# Altium project RADAR_D79_24V_R9.PrjPcb (part 2 of 2)

## Sheet 23_Radar_bypass.SchDoc
size 289 x 400 mm
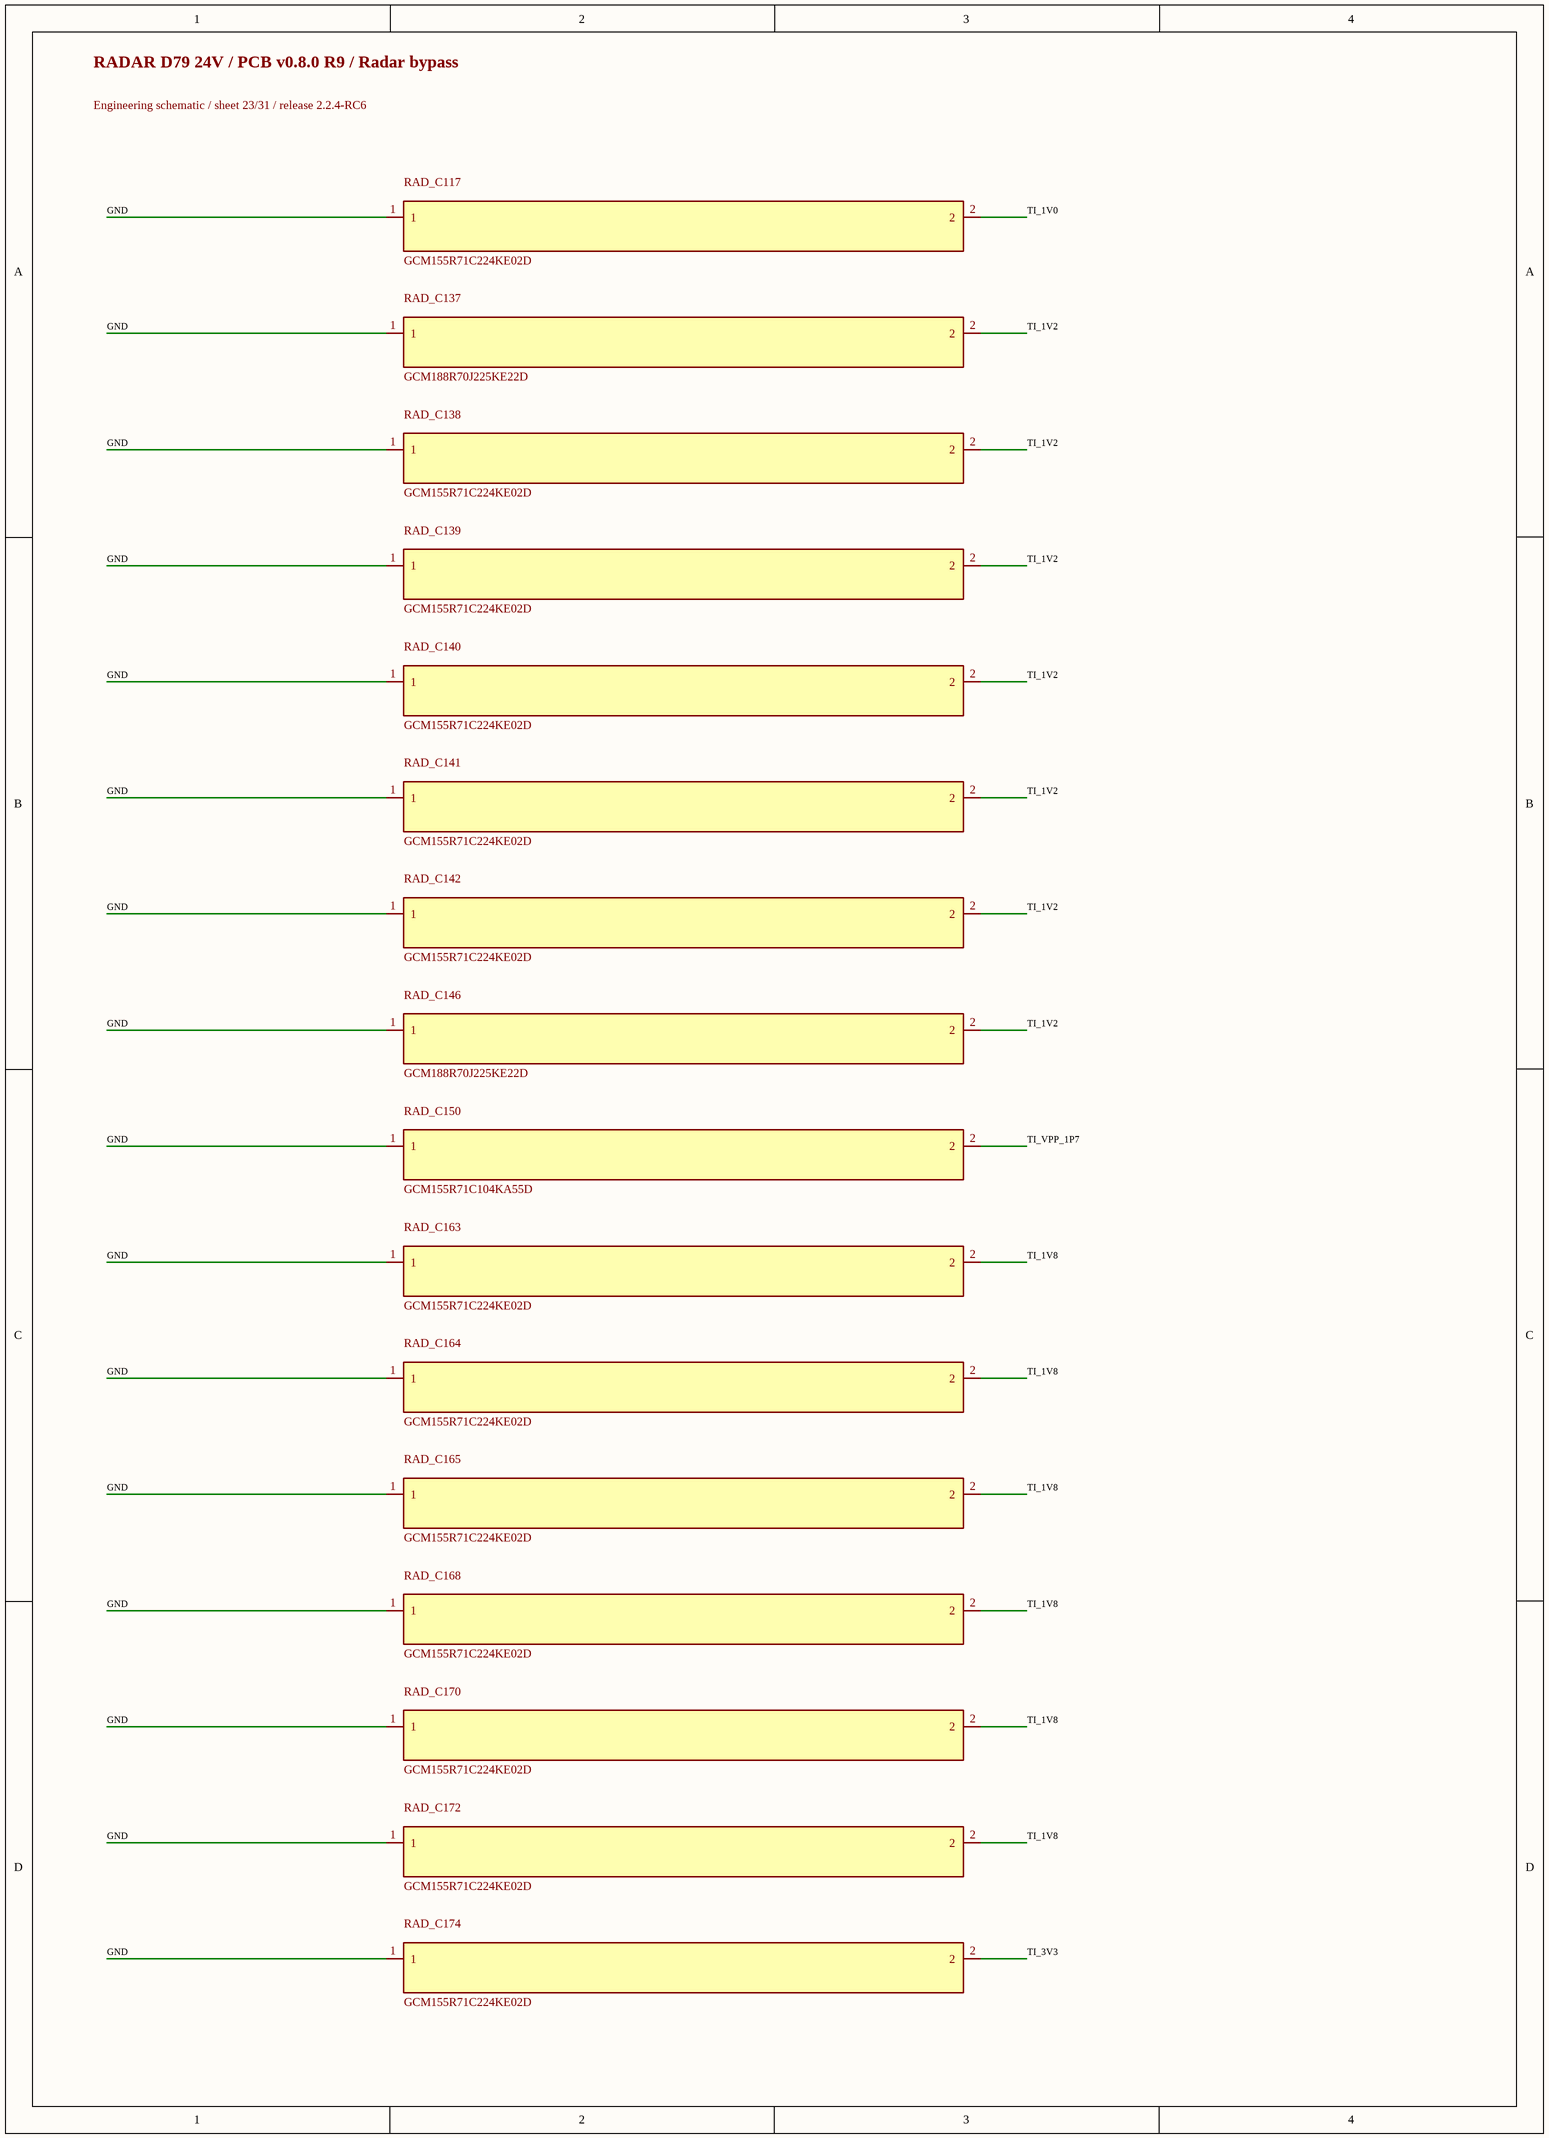
[diagram p23: 23_Radar_bypass.SchDoc]

### Parts
RAD_C117  GCM155R71C224KE02D  [0402L]
RAD_C137  GCM188R70J225KE22D  [0603L]
RAD_C138  GCM155R71C224KE02D  [0402L]
RAD_C139  GCM155R71C224KE02D  [0402L]
RAD_C140  GCM155R71C224KE02D  [0402L]
RAD_C141  GCM155R71C224KE02D  [0402L]
RAD_C142  GCM155R71C224KE02D  [0402L]
RAD_C146  GCM188R70J225KE22D  [0603L]
RAD_C150  GCM155R71C104KA55D  [0402L]
RAD_C163  GCM155R71C224KE02D  [0402L]
RAD_C164  GCM155R71C224KE02D  [0402L]
RAD_C165  GCM155R71C224KE02D  [0402L]
RAD_C168  GCM155R71C224KE02D  [0402L]
RAD_C170  GCM155R71C224KE02D  [0402L]
RAD_C172  GCM155R71C224KE02D  [0402L]
RAD_C174  GCM155R71C224KE02D  [0402L]

### Nets
GND: RAD_C117.1 RAD_C137.1 RAD_C138.1 RAD_C139.1 RAD_C140.1 RAD_C141.1 RAD_C142.1 RAD_C146.1 RAD_C150.1 RAD_C163.1 RAD_C164.1 RAD_C165.1 RAD_C168.1 RAD_C170.1 RAD_C172.1 RAD_C174.1
TI_1V0: RAD_C117.2
TI_1V2: RAD_C137.2 RAD_C138.2 RAD_C139.2 RAD_C140.2 RAD_C141.2 RAD_C142.2 RAD_C146.2
TI_1V8: RAD_C163.2 RAD_C164.2 RAD_C165.2 RAD_C168.2 RAD_C170.2 RAD_C172.2
TI_3V3: RAD_C174.2
TI_VPP_1P7: RAD_C150.2

### Notes on the sheet
- RADAR D79 24V / PCB v0.8.0 R9 / Radar bypass
- Engineering schematic / sheet 23/31 / release 2.2.4-RC6

## Sheet 24_Radar_bypass.SchDoc
size 289 x 396 mm
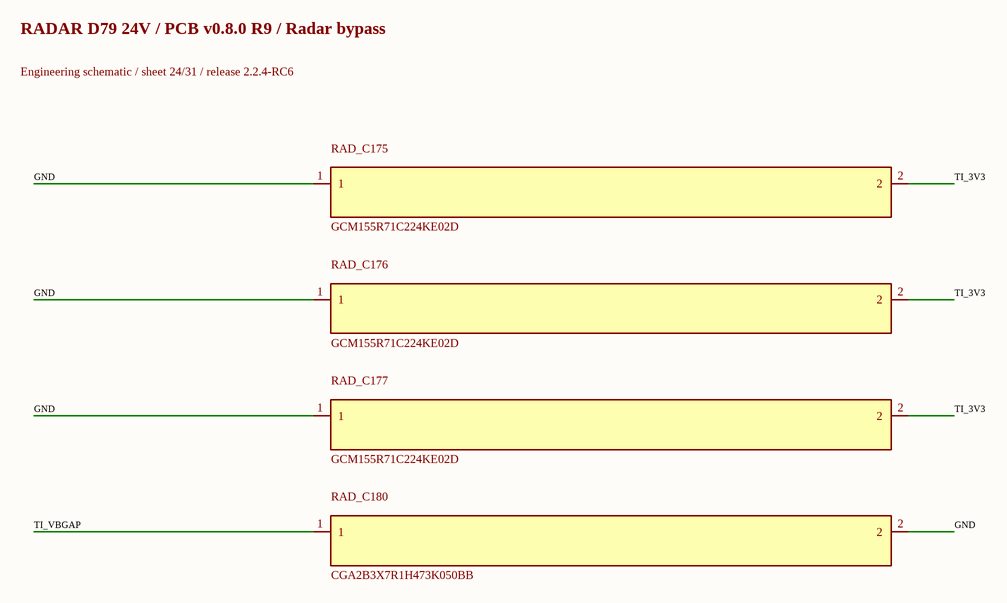
[diagram p24: 24_Radar_bypass.SchDoc]

### Parts
RAD_C175  GCM155R71C224KE02D  [0402L]
RAD_C176  GCM155R71C224KE02D  [0402L]
RAD_C177  GCM155R71C224KE02D  [0402L]
RAD_C180  CGA2B3X7R1H473K050BB  [0402L]

### Nets
GND: RAD_C175.1 RAD_C176.1 RAD_C177.1 RAD_C180.2
TI_3V3: RAD_C175.2 RAD_C176.2 RAD_C177.2
TI_VBGAP: RAD_C180.1

### Notes on the sheet
- RADAR D79 24V / PCB v0.8.0 R9 / Radar bypass
- Engineering schematic / sheet 24/31 / release 2.2.4-RC6

## Sheet 25_Radar_PMIC_and_rail_filters.SchDoc
size 289 x 396 mm
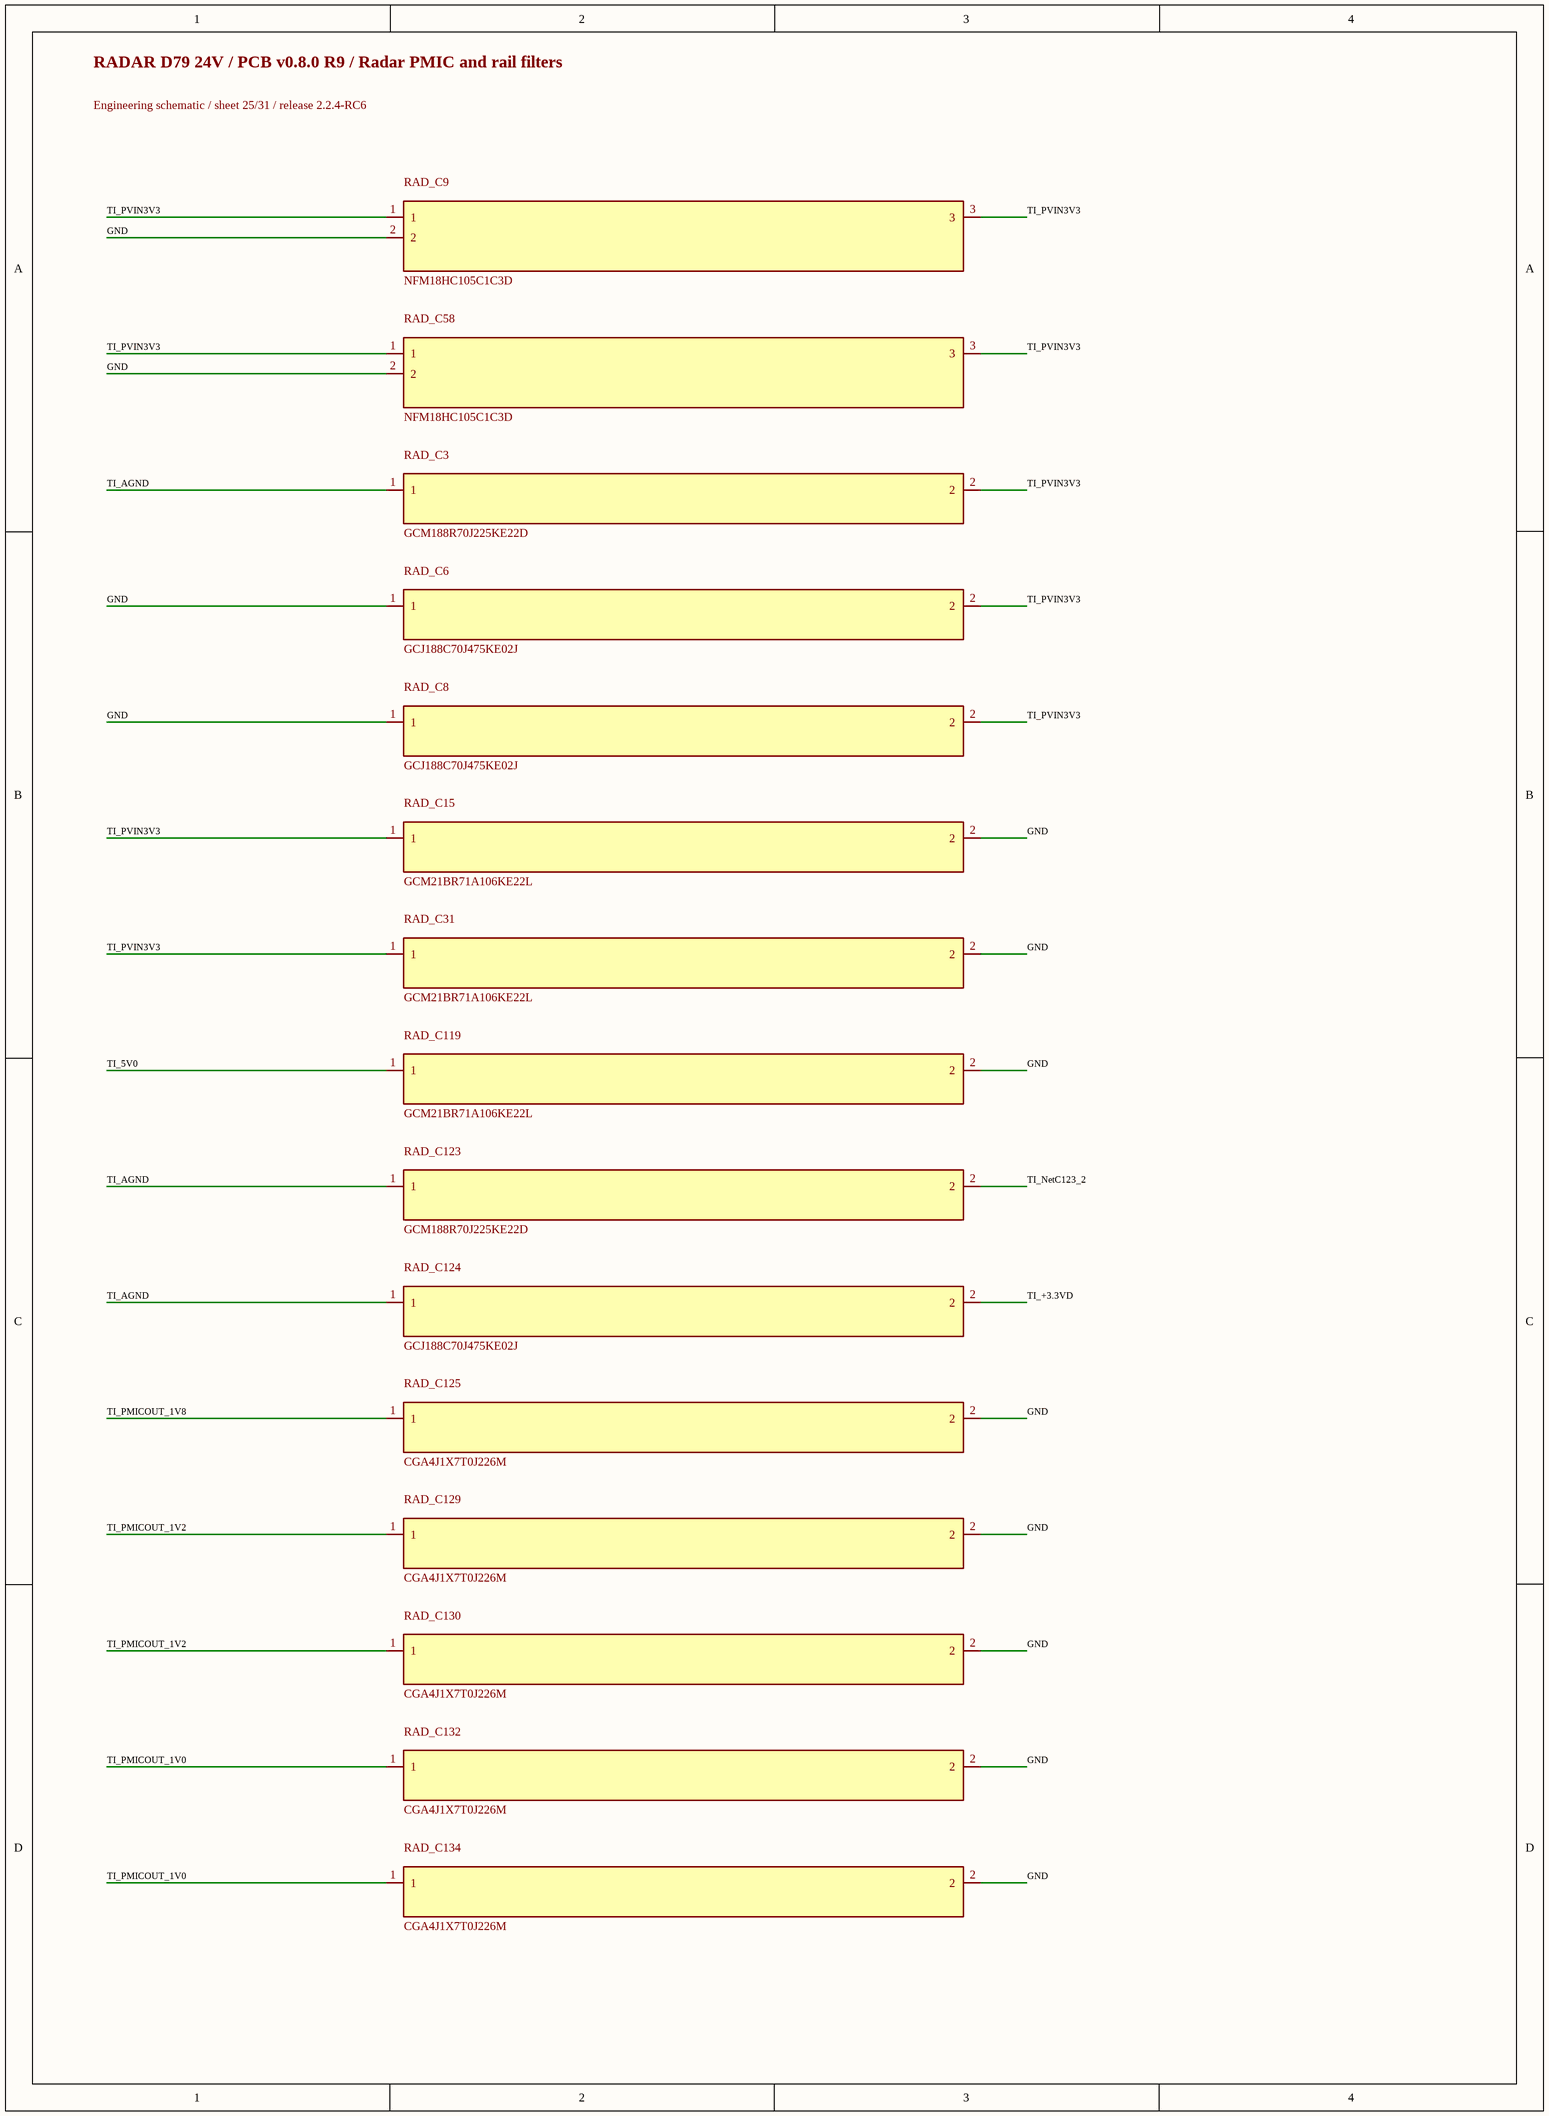
[diagram p25: 25_Radar_PMIC_and_rail_filters.SchDoc]

### Parts
RAD_C3  GCM188R70J225KE22D  [0603L]
RAD_C6  GCJ188C70J475KE02J  [FP-GCJ188C70J475KE02J_0603-MFG]
RAD_C8  GCJ188C70J475KE02J  [FP-GCJ188C70J475KE02J_0603-MFG]
RAD_C9  NFM18HC105C1C3D  [FP-NFM18HC105C1C3D_0603-MFG]
RAD_C15  GCM21BR71A106KE22L  [0805L]
RAD_C31  GCM21BR71A106KE22L  [0805L]
RAD_C58  NFM18HC105C1C3D  [FP-NFM18HC105C1C3D_0603-MFG]
RAD_C119  GCM21BR71A106KE22L  [0805L]
RAD_C123  GCM188R70J225KE22D  [0603L]
RAD_C124  GCJ188C70J475KE02J  [FP-GCJ188C70J475KE02J_0603-MFG]
RAD_C125  CGA4J1X7T0J226M  [0805_155]
RAD_C129  CGA4J1X7T0J226M  [0805_155]
RAD_C130  CGA4J1X7T0J226M  [0805_155]
RAD_C132  CGA4J1X7T0J226M  [0805_155]
RAD_C134  CGA4J1X7T0J226M  [0805_155]

### Nets
GND: RAD_C6.1 RAD_C8.1 RAD_C9.2 RAD_C15.2 RAD_C31.2 RAD_C58.2 RAD_C119.2 RAD_C125.2 RAD_C129.2 RAD_C130.2 RAD_C132.2 RAD_C134.2
TI_5V0: RAD_C119.1
TI_+3.3VD: RAD_C124.2
TI_AGND: RAD_C3.1 RAD_C123.1 RAD_C124.1
TI_NetC123_2: RAD_C123.2
TI_PMICOUT_1V0: RAD_C132.1 RAD_C134.1
TI_PMICOUT_1V2: RAD_C129.1 RAD_C130.1
TI_PMICOUT_1V8: RAD_C125.1
TI_PVIN3V3: RAD_C3.2 RAD_C6.2 RAD_C8.2 RAD_C9.1 RAD_C9.3 RAD_C15.1 RAD_C31.1 RAD_C58.1 RAD_C58.3

### Notes on the sheet
- RADAR D79 24V / PCB v0.8.0 R9 / Radar PMIC and rail filters
- Engineering schematic / sheet 25/31 / release 2.2.4-RC6

## Sheet 26_Radar_PMIC_and_rail_filters.SchDoc
size 289 x 400 mm
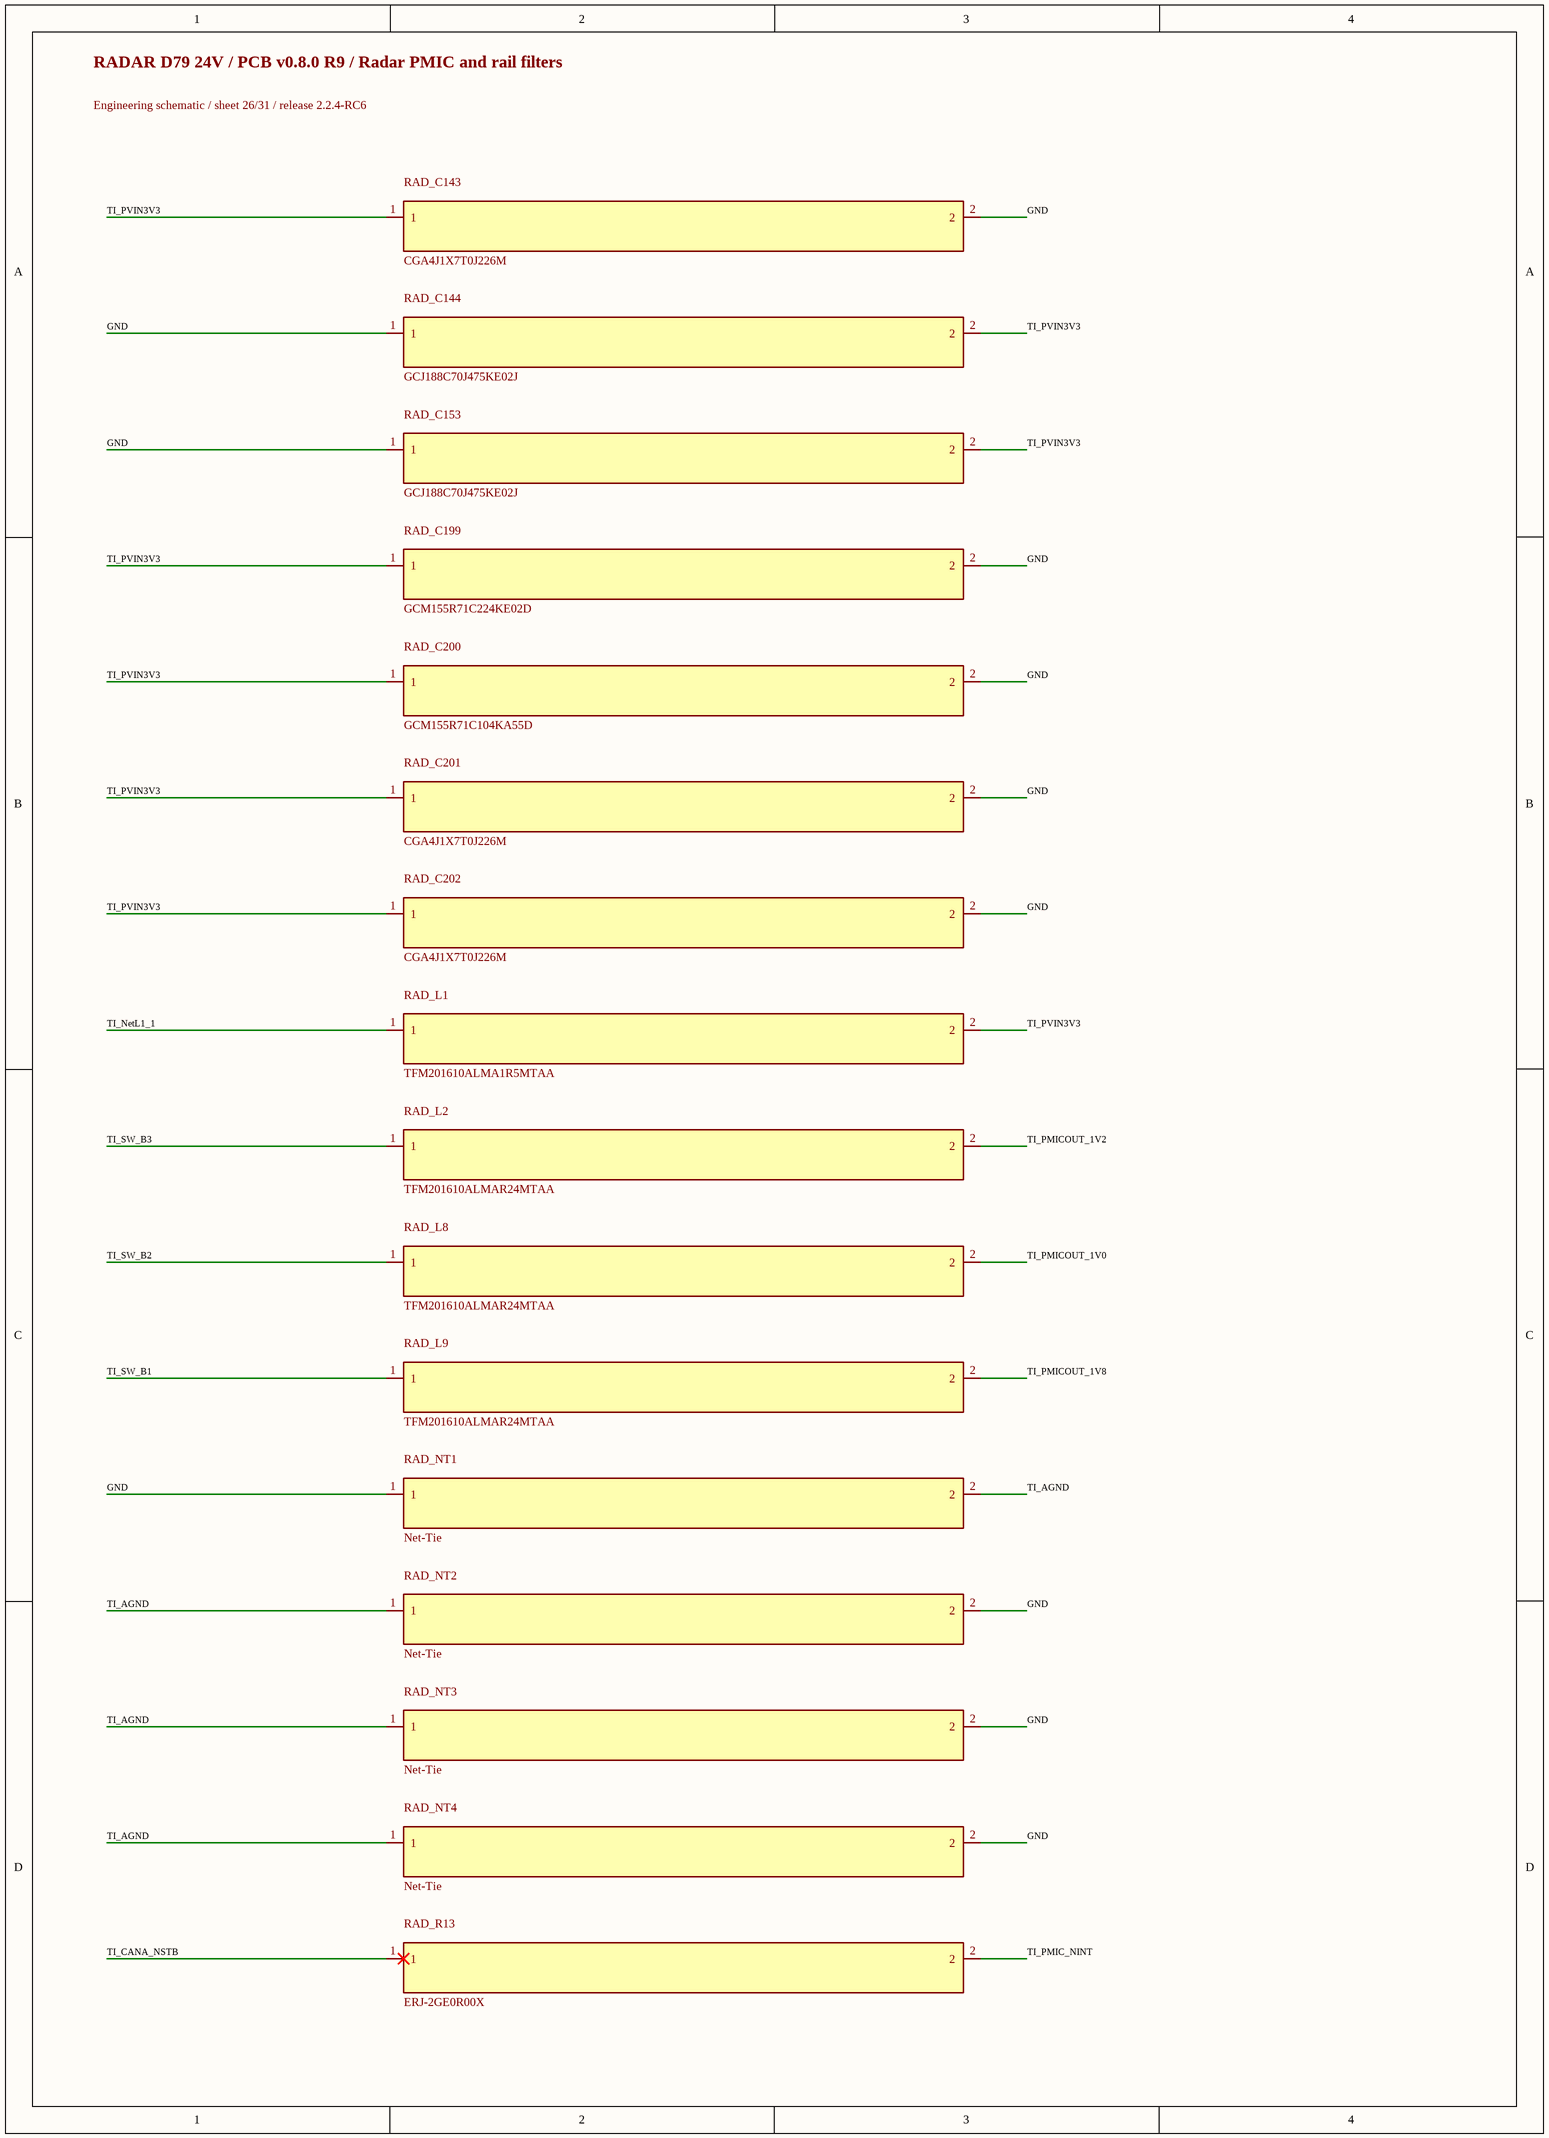
[diagram p26: 26_Radar_PMIC_and_rail_filters.SchDoc]

### Parts
RAD_C143  CGA4J1X7T0J226M  [0805_155]
RAD_C144  GCJ188C70J475KE02J  [FP-GCJ188C70J475KE02J_0603-MFG]
RAD_C153  GCJ188C70J475KE02J  [FP-GCJ188C70J475KE02J_0603-MFG]
RAD_C199  GCM155R71C224KE02D  [0402L]
RAD_C200  GCM155R71C104KA55D  [0402L]
RAD_C201  CGA4J1X7T0J226M  [0805_155]
RAD_C202  CGA4J1X7T0J226M  [0805_155]
RAD_L1  TFM201610ALMA1R5MTAA  [TFM201610ALMA]
RAD_L2  TFM201610ALMAR24MTAA  [FP-TFM201610ALMAR24MTAA_0806 (2016 Metric)-MFG]
RAD_L8  TFM201610ALMAR24MTAA  [FP-TFM201610ALMAR24MTAA_0806 (2016 Metric)-MFG]
RAD_L9  TFM201610ALMAR24MTAA  [FP-TFM201610ALMAR24MTAA_0806 (2016 Metric)-MFG]
RAD_NT1  Net-Tie  [Net-Tie_50milWide_30milLong]  (net tie, no BOM)
RAD_NT2  Net-Tie  [Net-Tie_50milWide_30milLong]  (net tie, no BOM)
RAD_NT3  Net-Tie  [Net-Tie_50milWide_30milLong]  (net tie, no BOM)
RAD_NT4  Net-Tie  [Net-Tie_50milWide_30milLong]  (net tie, no BOM)
RAD_R13  ERJ-2GE0R00X  [0402L]

### Nets
GND: RAD_C143.2 RAD_C144.1 RAD_C153.1 RAD_C199.2 RAD_C200.2 RAD_C201.2 RAD_C202.2 RAD_NT1.1 RAD_NT2.2 RAD_NT3.2 RAD_NT4.2
TI_AGND: RAD_NT1.2 RAD_NT2.1 RAD_NT3.1 RAD_NT4.1
TI_CANA_NSTB: RAD_R13.1
TI_NetL1_1: RAD_L1.1
TI_PMIC_NINT: RAD_R13.2
TI_PMICOUT_1V0: RAD_L8.2
TI_PMICOUT_1V2: RAD_L2.2
TI_PMICOUT_1V8: RAD_L9.2
TI_PVIN3V3: RAD_C143.1 RAD_C144.2 RAD_C153.2 RAD_C199.1 RAD_C200.1 RAD_C201.1 RAD_C202.1 RAD_L1.2
TI_SW_B1: RAD_L9.1
TI_SW_B2: RAD_L8.1
TI_SW_B3: RAD_L2.1

### Notes on the sheet
- RADAR D79 24V / PCB v0.8.0 R9 / Radar PMIC and rail filters
- Engineering schematic / sheet 26/31 / release 2.2.4-RC6

## Sheet 27_Radar_PMIC_and_rail_filters.SchDoc
size 289 x 400 mm
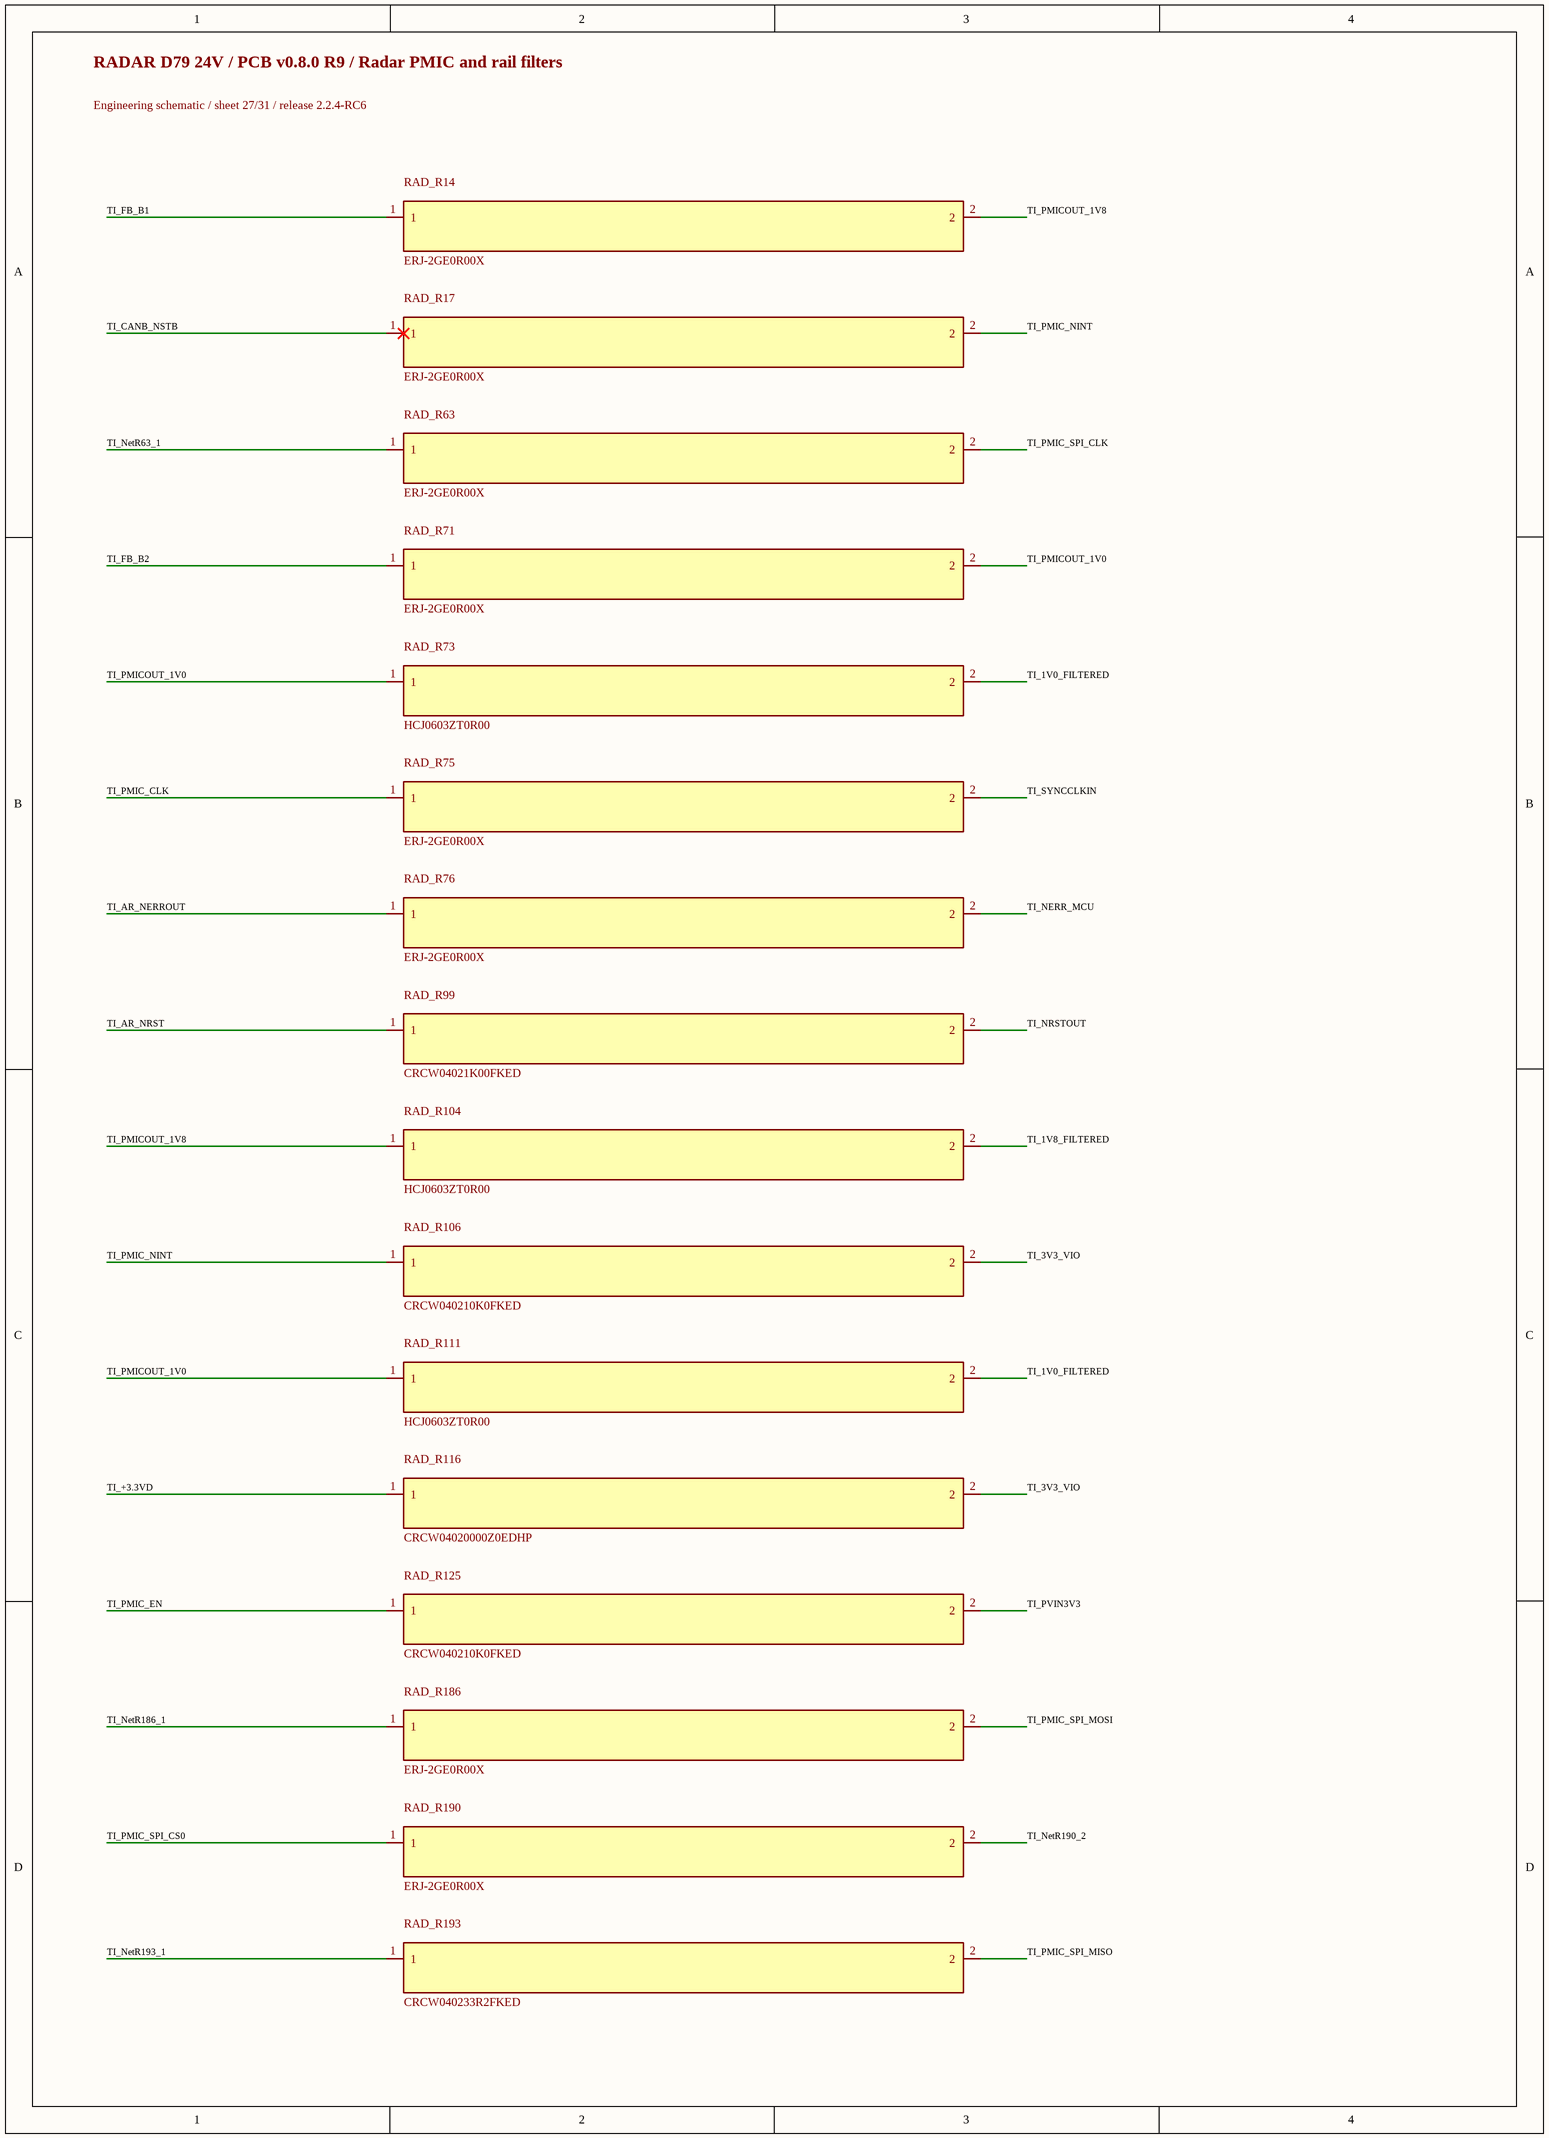
[diagram p27: 27_Radar_PMIC_and_rail_filters.SchDoc]

### Parts
RAD_R14  ERJ-2GE0R00X  [0402L]
RAD_R17  ERJ-2GE0R00X  [0402L]
RAD_R63  ERJ-2GE0R00X  [0402L]
RAD_R71  ERJ-2GE0R00X  [0402L]
RAD_R73  HCJ0603ZT0R00  [FP-HCJ0603ZT0R00_0603-MFG]
RAD_R75  ERJ-2GE0R00X  [0402L]
RAD_R76  ERJ-2GE0R00X  [0402L]
RAD_R99  CRCW04021K00FKED  [0402L]
RAD_R104  HCJ0603ZT0R00  [FP-HCJ0603ZT0R00_0603-MFG]
RAD_R106  CRCW040210K0FKED  [0402L]
RAD_R111  HCJ0603ZT0R00  [FP-HCJ0603ZT0R00_0603-MFG]
RAD_R116  CRCW04020000Z0EDHP  [0402L]
RAD_R125  CRCW040210K0FKED  [0402L]
RAD_R186  ERJ-2GE0R00X  [0402L]
RAD_R190  ERJ-2GE0R00X  [0402L]
RAD_R193  CRCW040233R2FKED  [0402L]

### Nets
TI_1V0_FILTERED: RAD_R73.2 RAD_R111.2
TI_1V8_FILTERED: RAD_R104.2
TI_3V3_VIO: RAD_R106.2 RAD_R116.2
TI_+3.3VD: RAD_R116.1
TI_AR_NERROUT: RAD_R76.1
TI_AR_NRST: RAD_R99.1
TI_CANB_NSTB: RAD_R17.1
TI_FB_B1: RAD_R14.1
TI_FB_B2: RAD_R71.1
TI_NERR_MCU: RAD_R76.2
TI_NetR63_1: RAD_R63.1
TI_NetR186_1: RAD_R186.1
TI_NetR190_2: RAD_R190.2
TI_NetR193_1: RAD_R193.1
TI_NRSTOUT: RAD_R99.2
TI_PMIC_CLK: RAD_R75.1
TI_PMIC_EN: RAD_R125.1
TI_PMIC_NINT: RAD_R17.2 RAD_R106.1
TI_PMIC_SPI_CLK: RAD_R63.2
TI_PMIC_SPI_CS0: RAD_R190.1
TI_PMIC_SPI_MISO: RAD_R193.2
TI_PMIC_SPI_MOSI: RAD_R186.2
TI_PMICOUT_1V0: RAD_R71.2 RAD_R73.1 RAD_R111.1
TI_PMICOUT_1V8: RAD_R14.2 RAD_R104.1
TI_PVIN3V3: RAD_R125.2
TI_SYNCCLKIN: RAD_R75.2

### Notes on the sheet
- RADAR D79 24V / PCB v0.8.0 R9 / Radar PMIC and rail filters
- Engineering schematic / sheet 27/31 / release 2.2.4-RC6

## Sheet 28_Radar_PMIC_and_rail_filters.SchDoc
size 289 x 396 mm
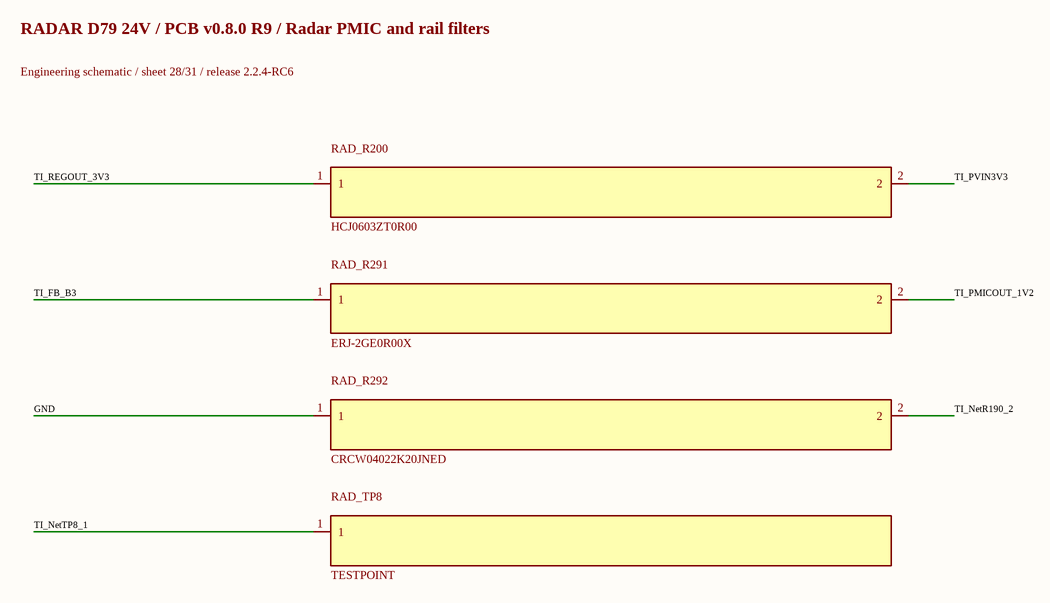
[diagram p28: 28_Radar_PMIC_and_rail_filters.SchDoc]

### Parts
RAD_R200  HCJ0603ZT0R00  [FP-HCJ0603ZT0R00_0603-MFG]
RAD_R291  ERJ-2GE0R00X  [0402L]
RAD_R292  CRCW04022K20JNED  [0402L]
RAD_TP8  TESTPOINT  [TP_25MIL-SMT]

### Nets
GND: RAD_R292.1
TI_FB_B3: RAD_R291.1
TI_NetR190_2: RAD_R292.2
TI_NetTP8_1: RAD_TP8.1
TI_PMICOUT_1V2: RAD_R291.2
TI_PVIN3V3: RAD_R200.2
TI_REGOUT_3V3: RAD_R200.1

### Notes on the sheet
- RADAR D79 24V / PCB v0.8.0 R9 / Radar PMIC and rail filters
- Engineering schematic / sheet 28/31 / release 2.2.4-RC6

## Sheet 29_Radar_rail_selection_and_sensing.SchDoc
size 289 x 396 mm
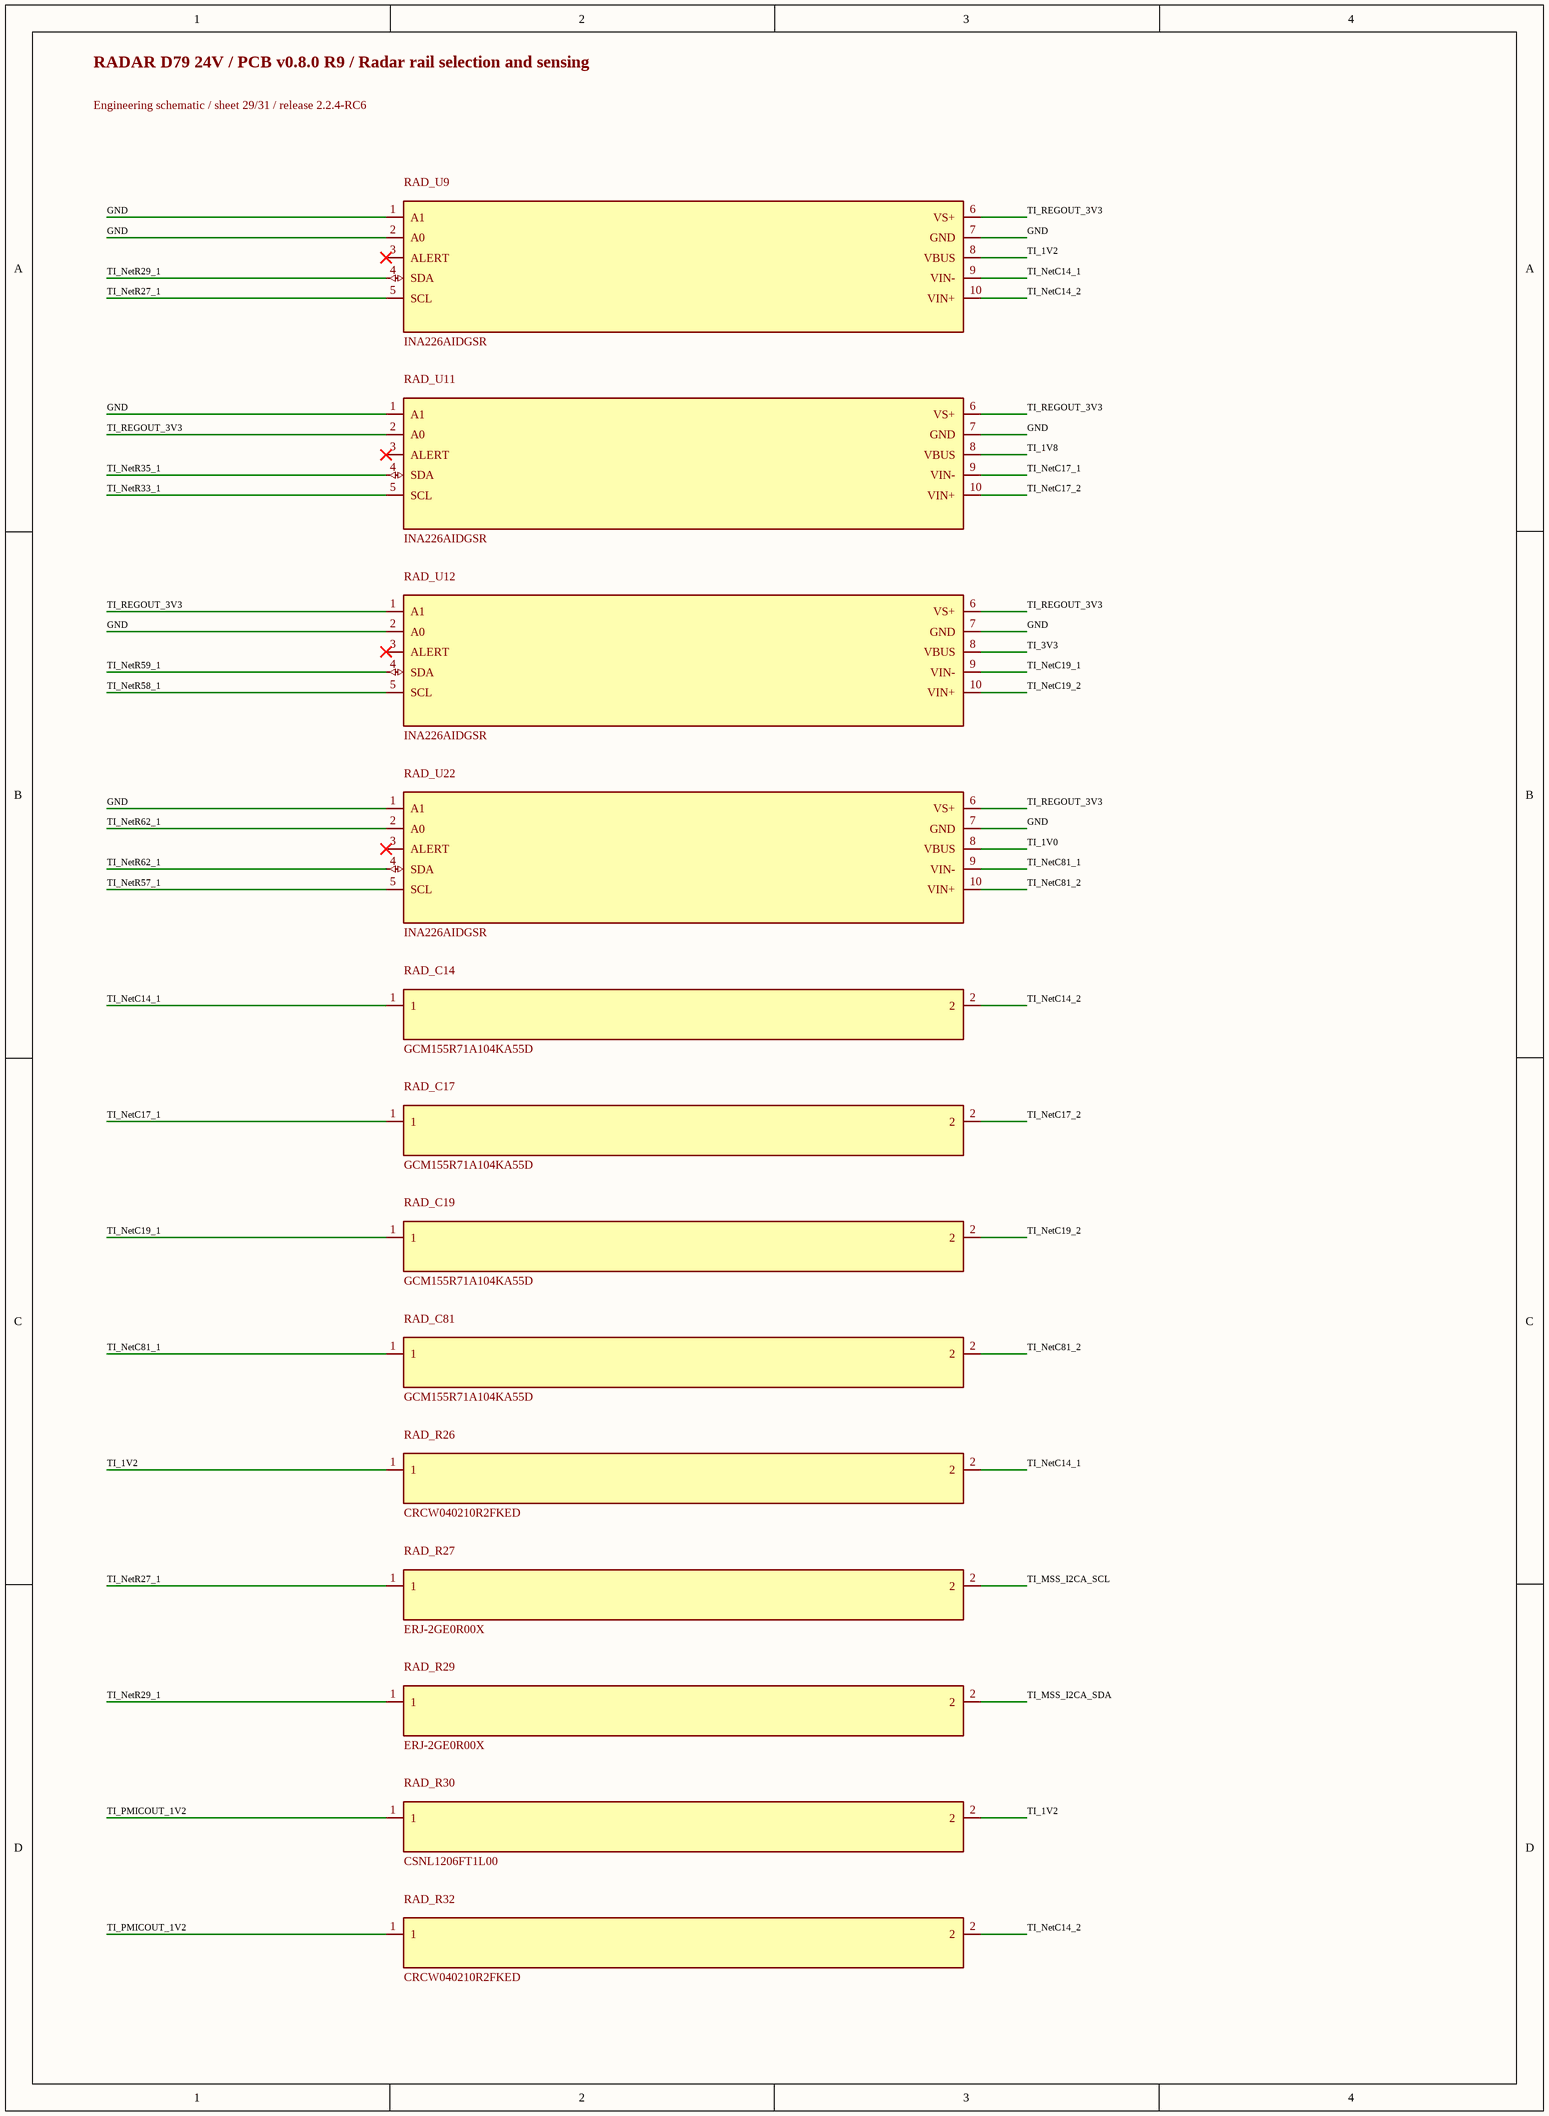
[diagram p29: 29_Radar_rail_selection_and_sensing.SchDoc]

### Parts
RAD_C14  GCM155R71A104KA55D  [0402L]
RAD_C17  GCM155R71A104KA55D  [0402L]
RAD_C19  GCM155R71A104KA55D  [0402L]
RAD_C81  GCM155R71A104KA55D  [0402L]
RAD_R26  CRCW040210R2FKED  [0402L]
RAD_R27  ERJ-2GE0R00X  [0402L]
RAD_R29  ERJ-2GE0R00X  [0402L]
RAD_R30  CSNL1206FT1L00  [1206L]
RAD_R32  CRCW040210R2FKED  [0402L]
RAD_U9  INA226AIDGSR  [DGS0010A_L]
RAD_U11  INA226AIDGSR  [DGS0010A_L]
RAD_U12  INA226AIDGSR  [DGS0010A_L]
RAD_U22  INA226AIDGSR  [DGS0010A_L]

### Nets
GND: RAD_U9.1(A1) RAD_U9.2(A0) RAD_U9.7(GND) RAD_U11.1(A1) RAD_U11.7(GND) RAD_U12.2(A0) RAD_U12.7(GND) RAD_U22.1(A1) RAD_U22.7(GND)
TI_1V0: RAD_U22.8(VBUS)
TI_1V2: RAD_R26.1 RAD_R30.2 RAD_U9.8(VBUS)
TI_1V8: RAD_U11.8(VBUS)
TI_3V3: RAD_U12.8(VBUS)
TI_MSS_I2CA_SCL: RAD_R27.2
TI_MSS_I2CA_SDA: RAD_R29.2
TI_NetC14_1: RAD_C14.1 RAD_R26.2 RAD_U9.9(VIN-)
TI_NetC14_2: RAD_C14.2 RAD_R32.2 RAD_U9.10(VIN+)
TI_NetC17_1: RAD_C17.1 RAD_U11.9(VIN-)
TI_NetC17_2: RAD_C17.2 RAD_U11.10(VIN+)
TI_NetC19_1: RAD_C19.1 RAD_U12.9(VIN-)
TI_NetC19_2: RAD_C19.2 RAD_U12.10(VIN+)
TI_NetC81_1: RAD_C81.1 RAD_U22.9(VIN-)
TI_NetC81_2: RAD_C81.2 RAD_U22.10(VIN+)
TI_NetR27_1: RAD_R27.1 RAD_U9.5(SCL)
TI_NetR29_1: RAD_R29.1 RAD_U9.4(SDA)
TI_NetR33_1: RAD_U11.5(SCL)
TI_NetR35_1: RAD_U11.4(SDA)
TI_NetR57_1: RAD_U22.5(SCL)
TI_NetR58_1: RAD_U12.5(SCL)
TI_NetR59_1: RAD_U12.4(SDA)
TI_NetR62_1: RAD_U22.2(A0) RAD_U22.4(SDA)
TI_PMICOUT_1V2: RAD_R30.1 RAD_R32.1
TI_REGOUT_3V3: RAD_U9.6(VS+) RAD_U11.2(A0) RAD_U11.6(VS+) RAD_U12.1(A1) RAD_U12.6(VS+) RAD_U22.6(VS+)

Not connected (* = marked no-connect by the designer): RAD_U9 3(ALERT)*; RAD_U11 3(ALERT)*; RAD_U12 3(ALERT)*; RAD_U22 3(ALERT)*

### Notes on the sheet
- RADAR D79 24V / PCB v0.8.0 R9 / Radar rail selection and sensing
- Engineering schematic / sheet 29/31 / release 2.2.4-RC6

## Sheet 30_Radar_rail_selection_and_sensing.SchDoc
size 289 x 396 mm
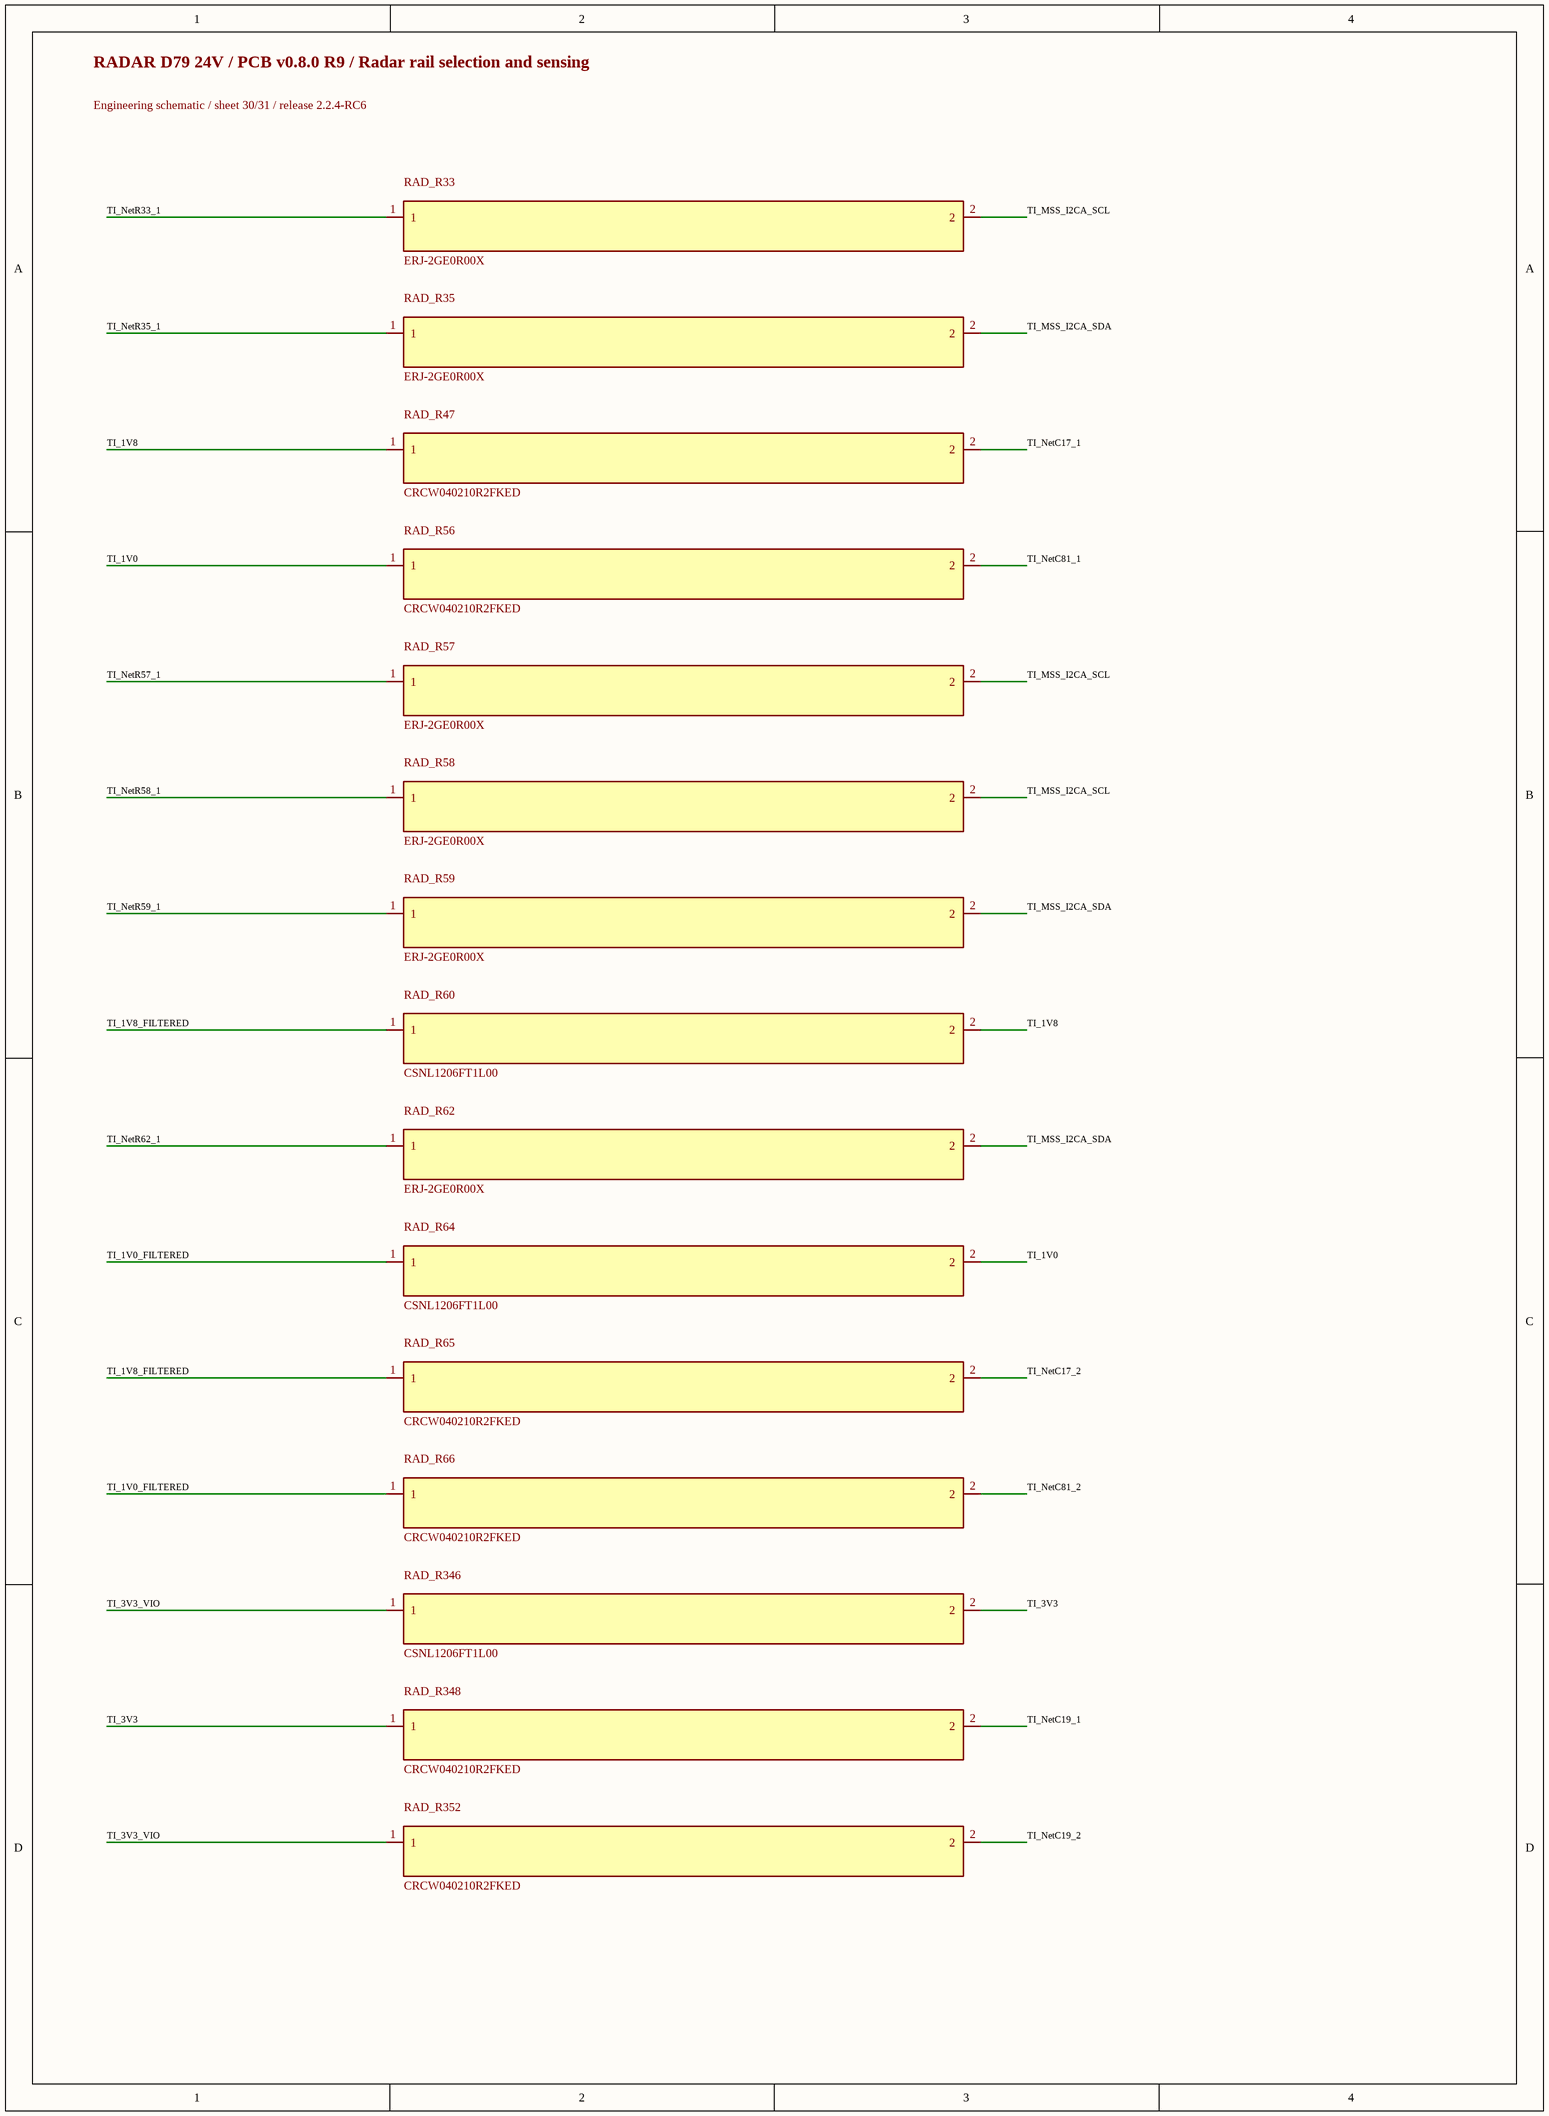
[diagram p30: 30_Radar_rail_selection_and_sensing.SchDoc]

### Parts
RAD_R33  ERJ-2GE0R00X  [0402L]
RAD_R35  ERJ-2GE0R00X  [0402L]
RAD_R47  CRCW040210R2FKED  [0402L]
RAD_R56  CRCW040210R2FKED  [0402L]
RAD_R57  ERJ-2GE0R00X  [0402L]
RAD_R58  ERJ-2GE0R00X  [0402L]
RAD_R59  ERJ-2GE0R00X  [0402L]
RAD_R60  CSNL1206FT1L00  [1206L]
RAD_R62  ERJ-2GE0R00X  [0402L]
RAD_R64  CSNL1206FT1L00  [1206L]
RAD_R65  CRCW040210R2FKED  [0402L]
RAD_R66  CRCW040210R2FKED  [0402L]
RAD_R346  CSNL1206FT1L00  [1206L]
RAD_R348  CRCW040210R2FKED  [0402L]
RAD_R352  CRCW040210R2FKED  [0402L]

### Nets
TI_1V0: RAD_R56.1 RAD_R64.2
TI_1V0_FILTERED: RAD_R64.1 RAD_R66.1
TI_1V8: RAD_R47.1 RAD_R60.2
TI_1V8_FILTERED: RAD_R60.1 RAD_R65.1
TI_3V3: RAD_R346.2 RAD_R348.1
TI_3V3_VIO: RAD_R346.1 RAD_R352.1
TI_MSS_I2CA_SCL: RAD_R33.2 RAD_R57.2 RAD_R58.2
TI_MSS_I2CA_SDA: RAD_R35.2 RAD_R59.2 RAD_R62.2
TI_NetC17_1: RAD_R47.2
TI_NetC17_2: RAD_R65.2
TI_NetC19_1: RAD_R348.2
TI_NetC19_2: RAD_R352.2
TI_NetC81_1: RAD_R56.2
TI_NetC81_2: RAD_R66.2
TI_NetR33_1: RAD_R33.1
TI_NetR35_1: RAD_R35.1
TI_NetR57_1: RAD_R57.1
TI_NetR58_1: RAD_R58.1
TI_NetR59_1: RAD_R59.1
TI_NetR62_1: RAD_R62.1

### Notes on the sheet
- RADAR D79 24V / PCB v0.8.0 R9 / Radar rail selection and sensing
- Engineering schematic / sheet 30/31 / release 2.2.4-RC6

## Sheet 31_Radar_VPP_service.SchDoc
size 289 x 396 mm
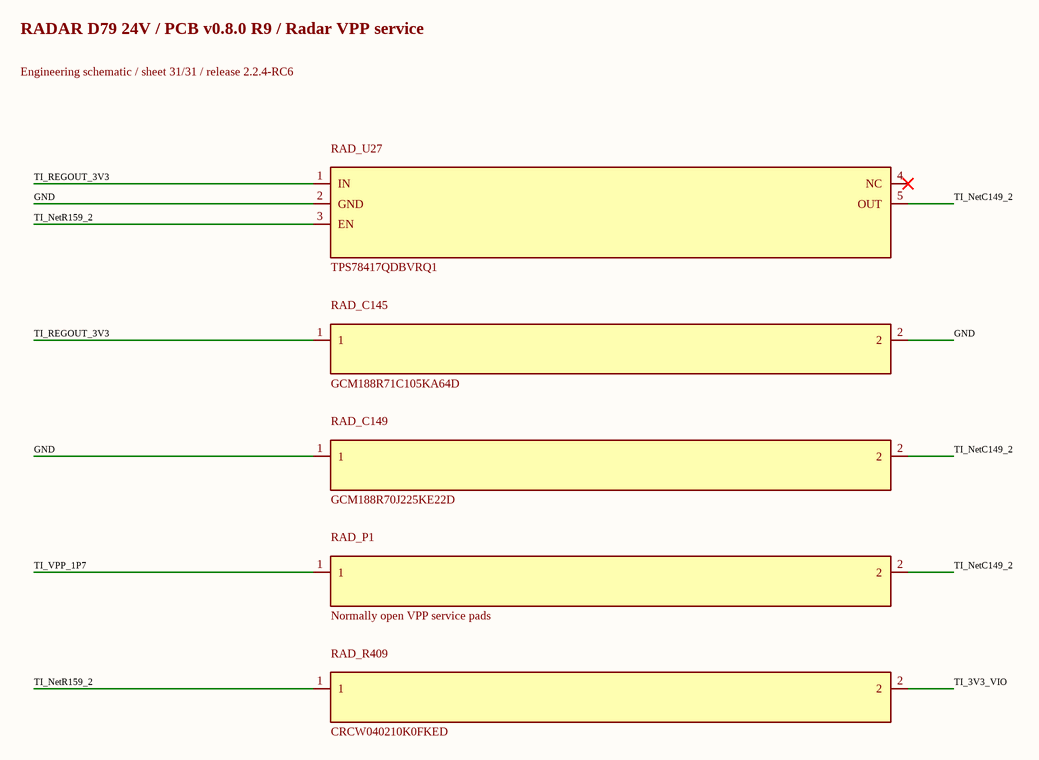
[diagram p31: 31_Radar_VPP_service.SchDoc]

### Parts
RAD_C145  GCM188R71C105KA64D  [0603L]
RAD_C149  GCM188R70J225KE22D  [0603L]
RAD_P1  Normally open VPP service pads  [VPP_SERVICE_SMT_D1p5_P2p5]
RAD_R409  CRCW040210K0FKED  [0402L]
RAD_U27  TPS78417QDBVRQ1  [DBV0005A-MFG]

### Nets
GND: RAD_C145.2 RAD_C149.1 RAD_U27.2(GND)
TI_3V3_VIO: RAD_R409.2
TI_NetC149_2: RAD_C149.2 RAD_P1.2 RAD_U27.5(OUT)
TI_NetR159_2: RAD_R409.1 RAD_U27.3(EN)
TI_REGOUT_3V3: RAD_C145.1 RAD_U27.1(IN)
TI_VPP_1P7: RAD_P1.1

Not connected (* = marked no-connect by the designer): RAD_U27 4(NC)*

### Notes on the sheet
- RADAR D79 24V / PCB v0.8.0 R9 / Radar VPP service
- Engineering schematic / sheet 31/31 / release 2.2.4-RC6

## Sheet 00_SYSTEM_OVERVIEW.SchDoc
size 840 x 594 mm
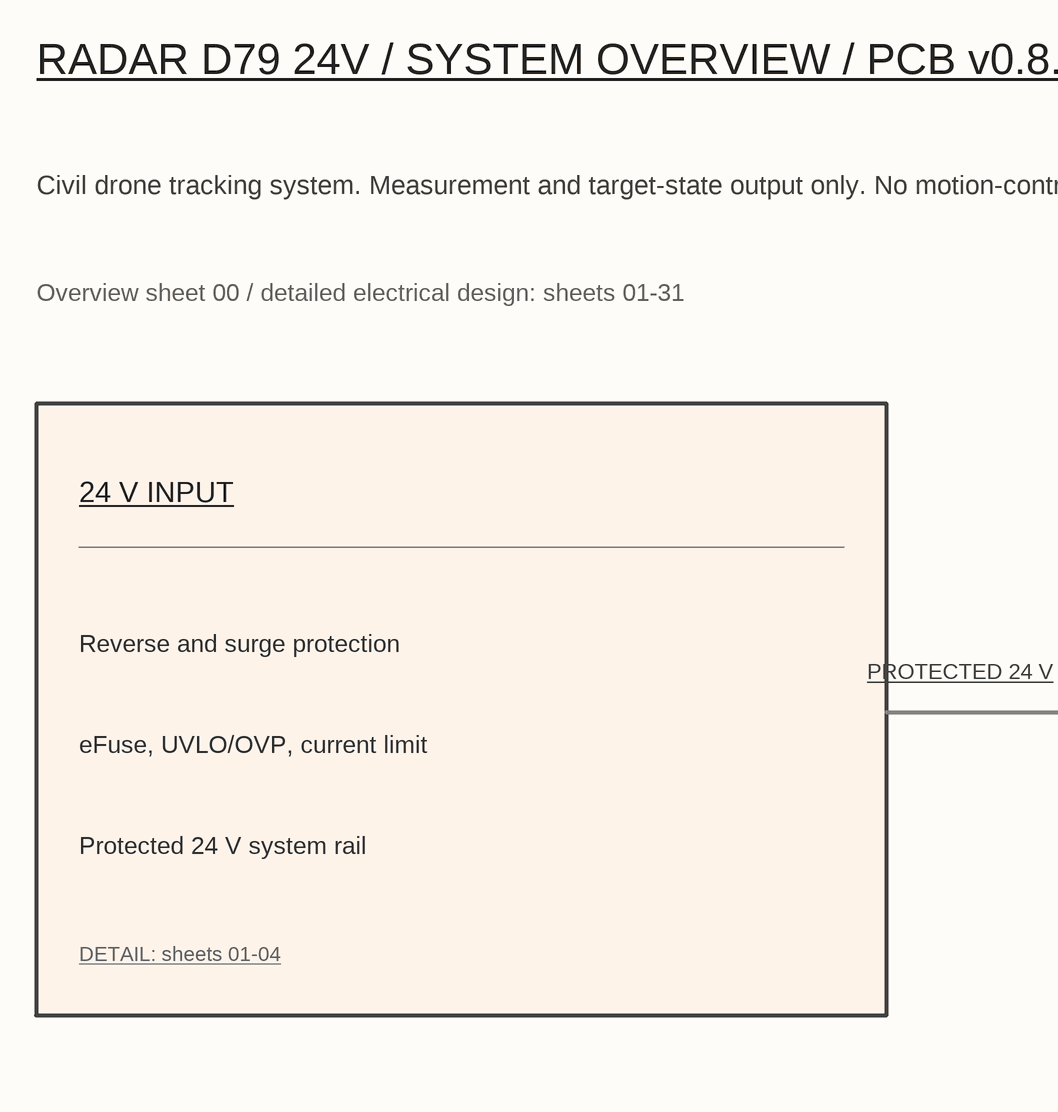
[diagram p32: 00_SYSTEM_OVERVIEW.SchDoc, top left]
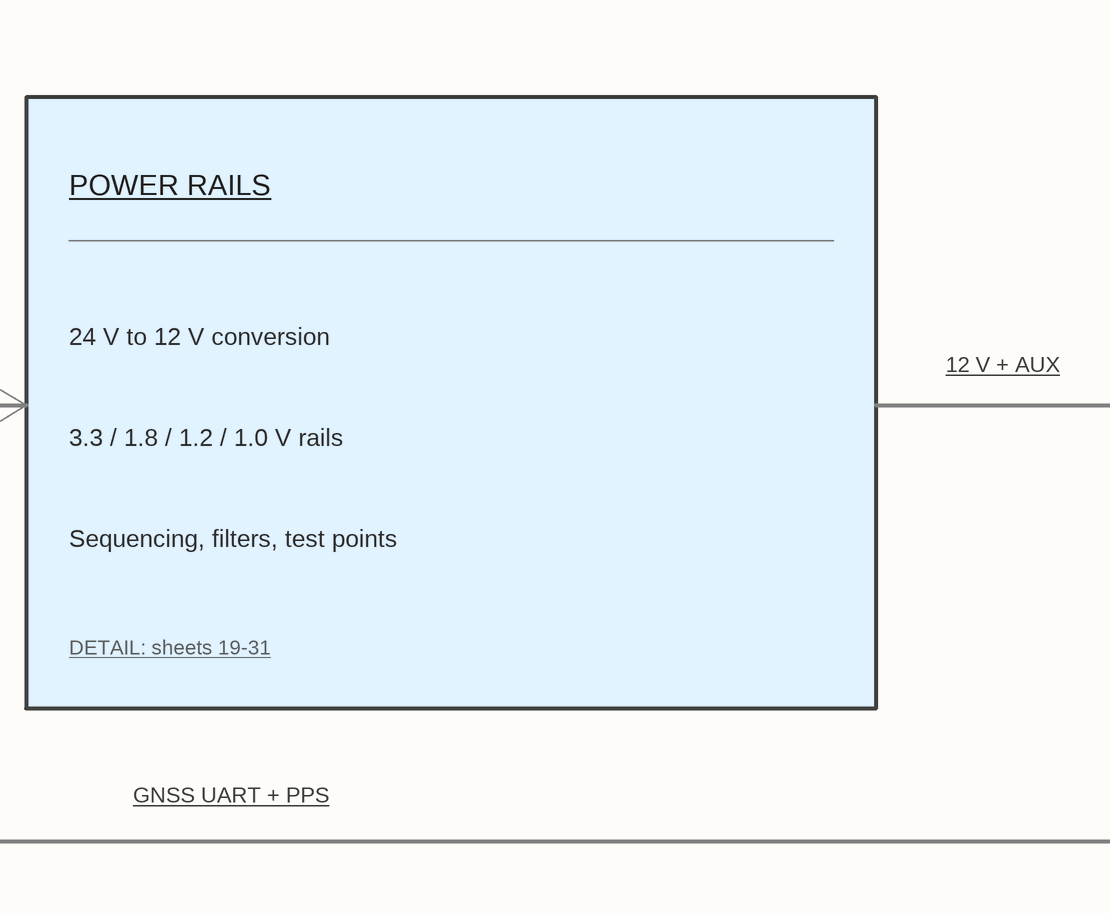
[diagram p33: 00_SYSTEM_OVERVIEW.SchDoc, top middle]
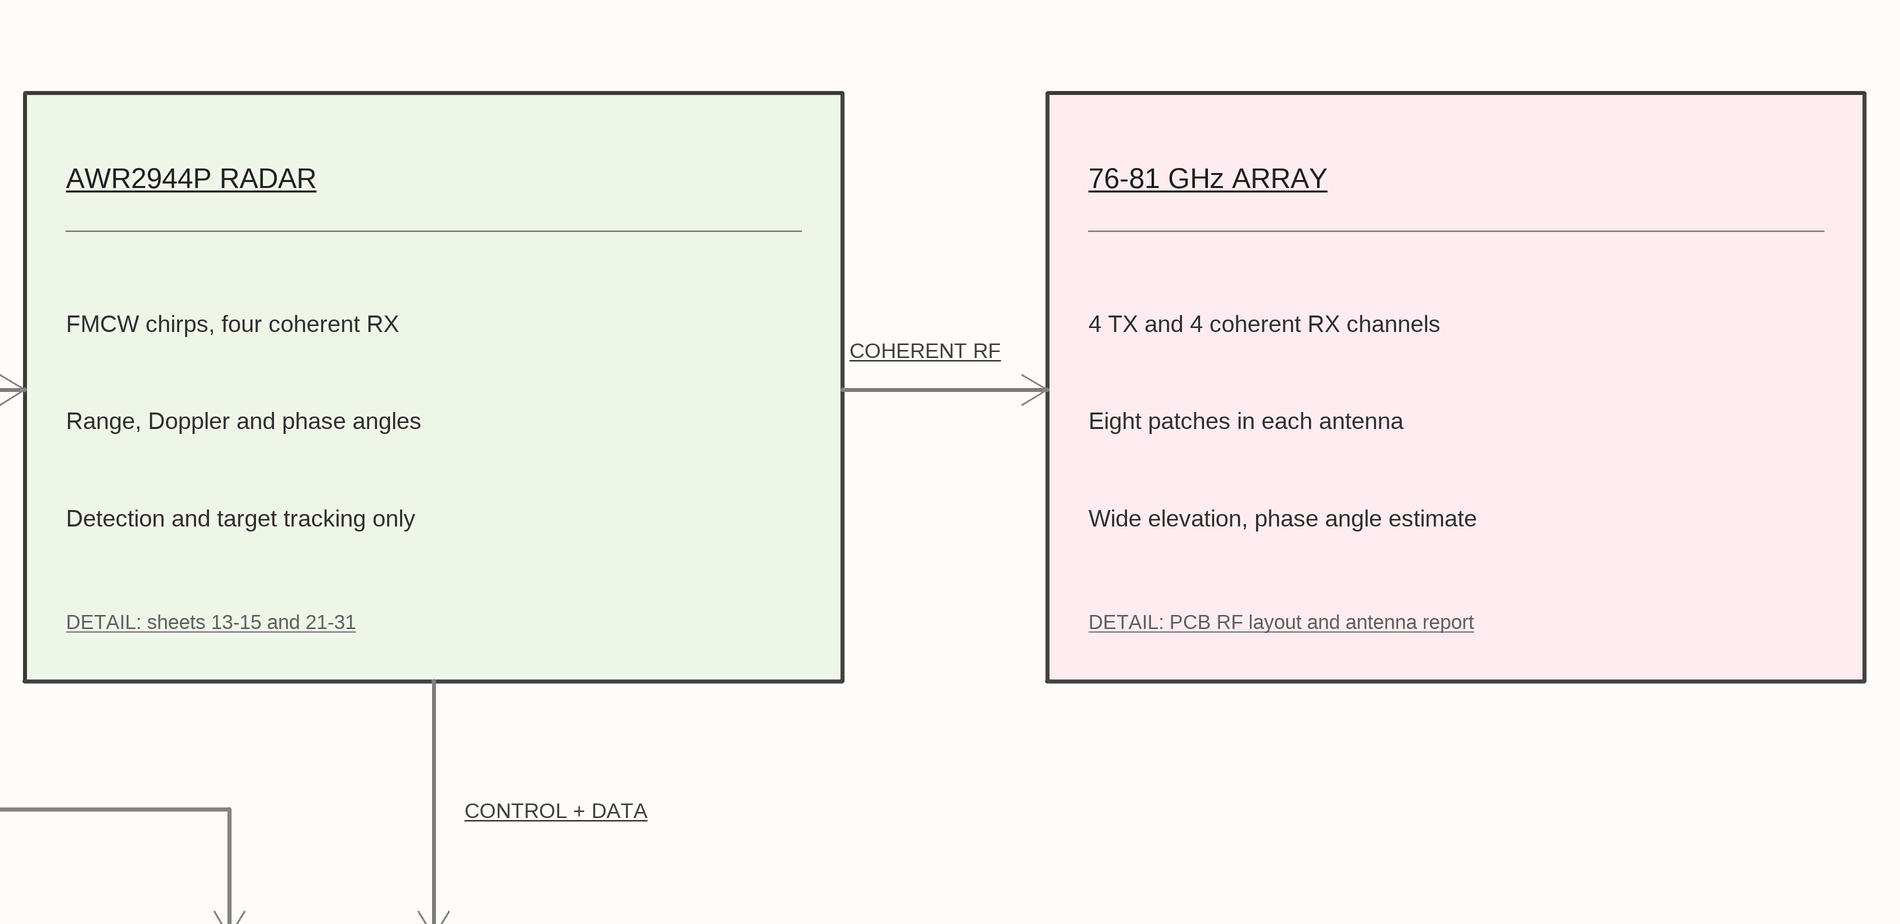
[diagram p34: 00_SYSTEM_OVERVIEW.SchDoc, top right]
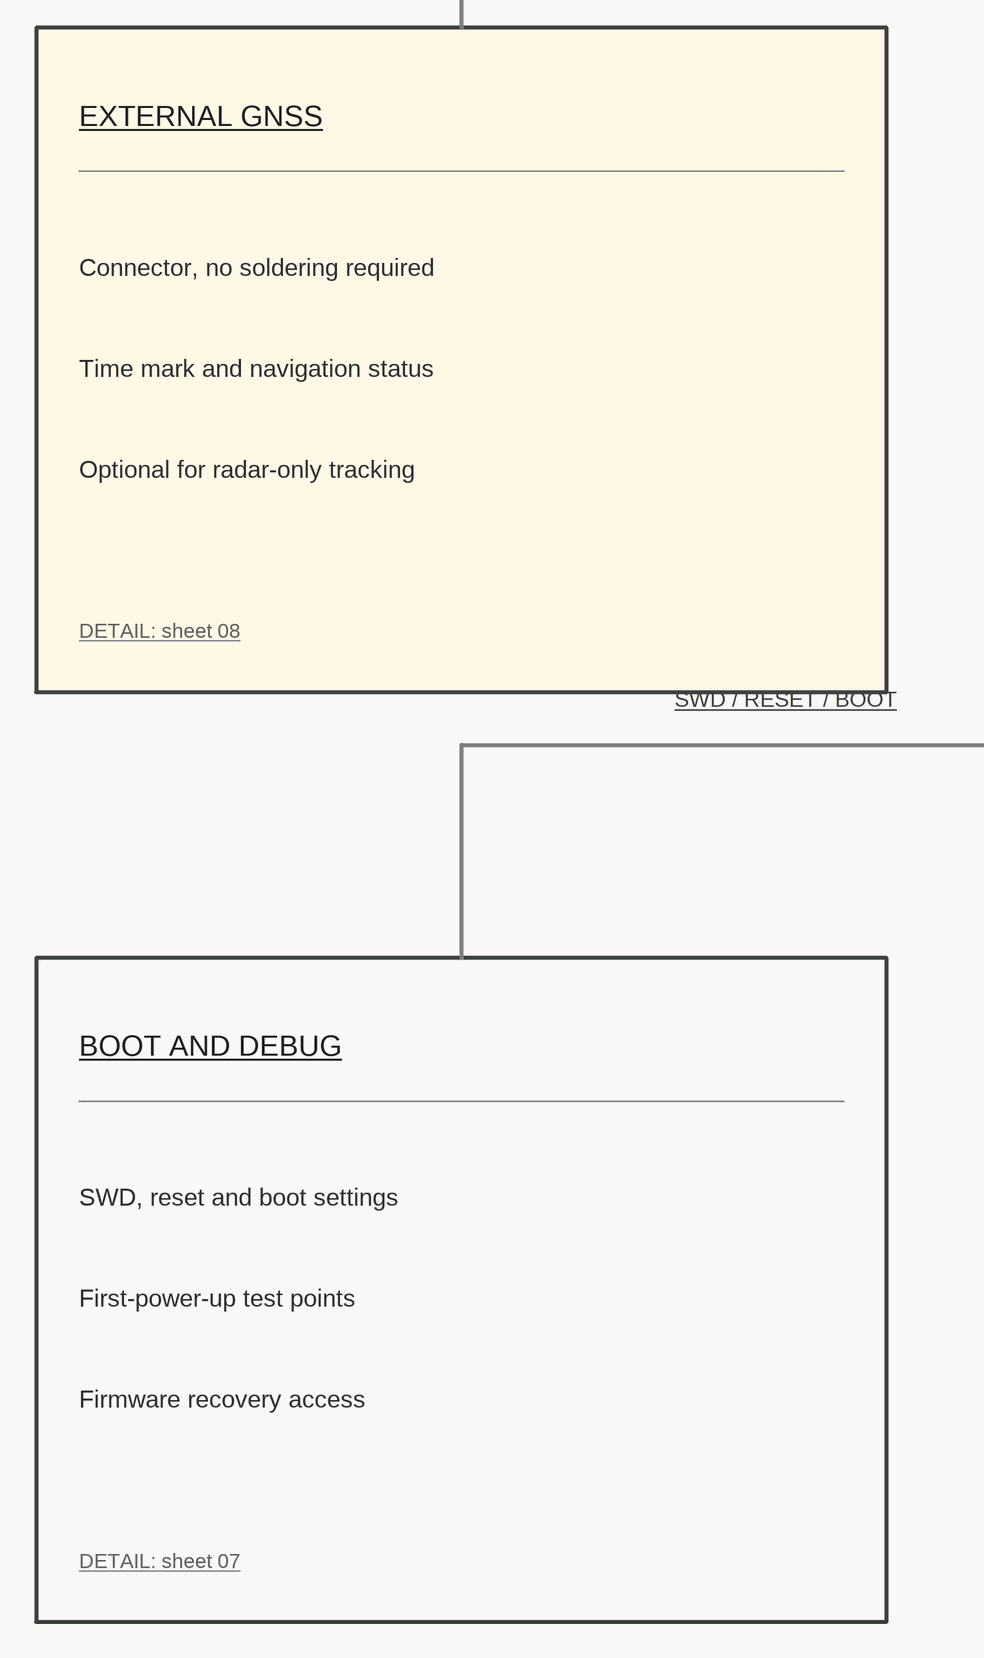
[diagram p35: 00_SYSTEM_OVERVIEW.SchDoc, bottom left]
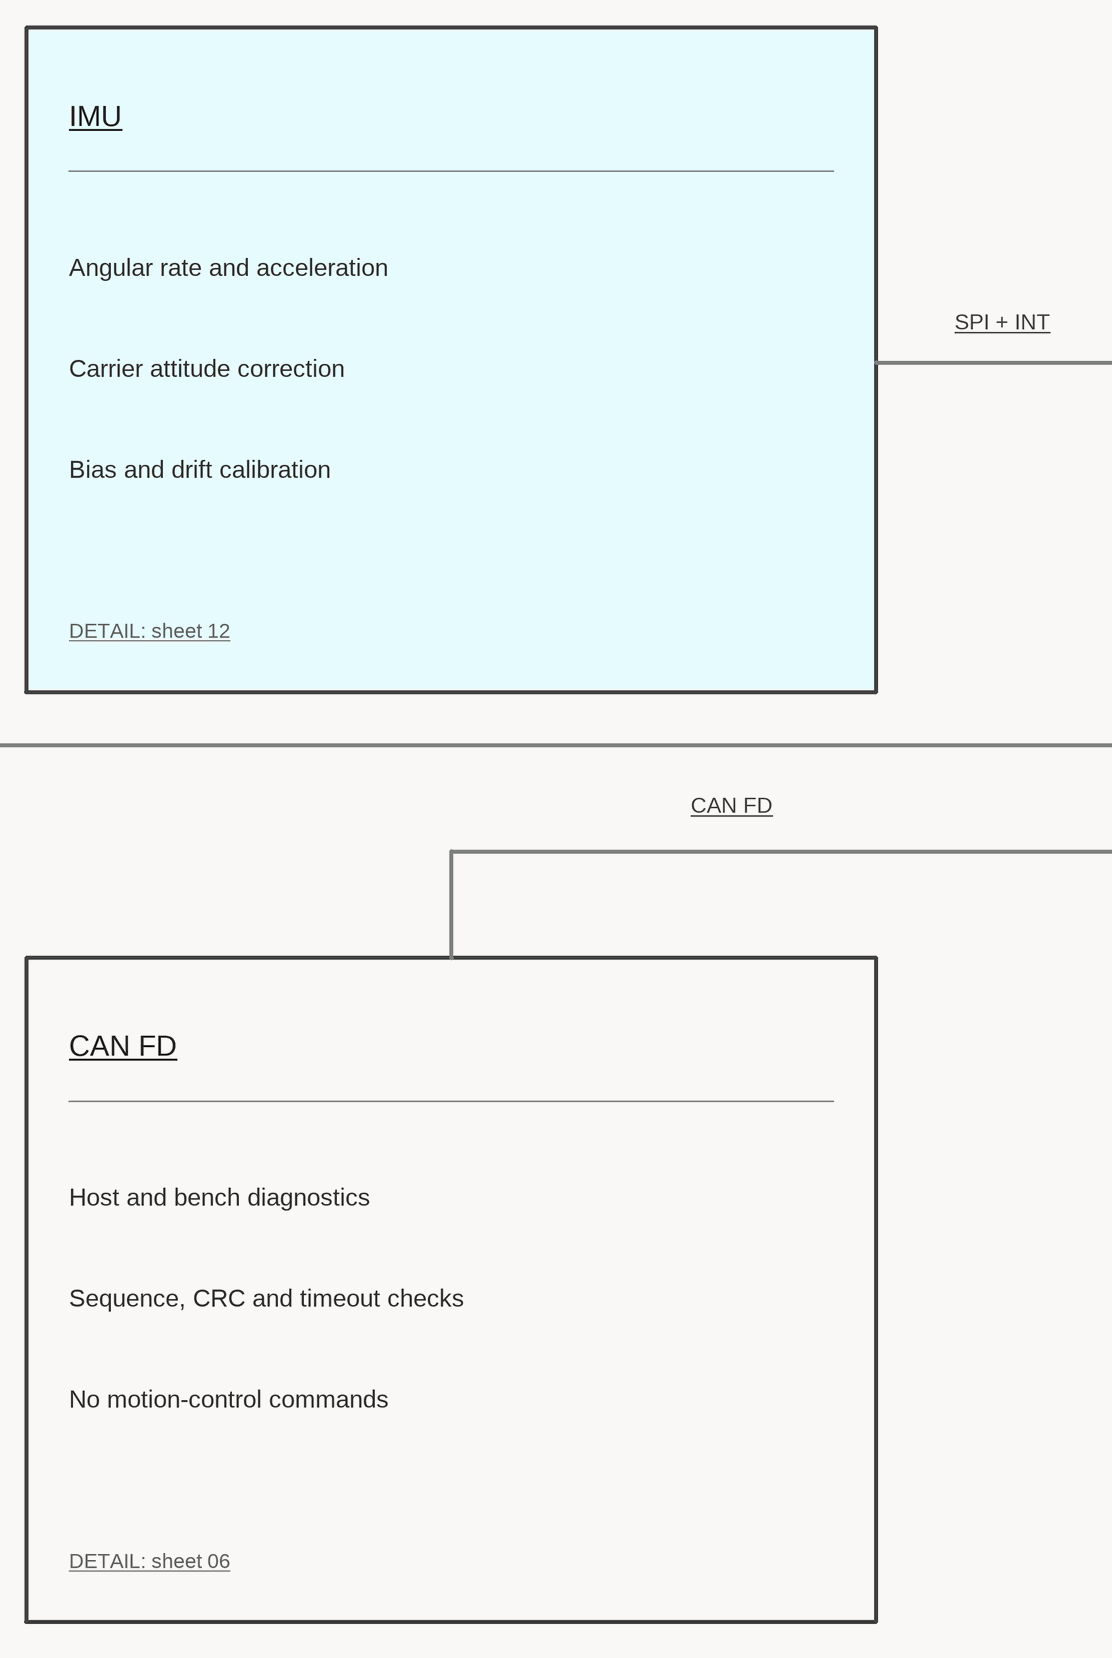
[diagram p36: 00_SYSTEM_OVERVIEW.SchDoc, bottom middle]
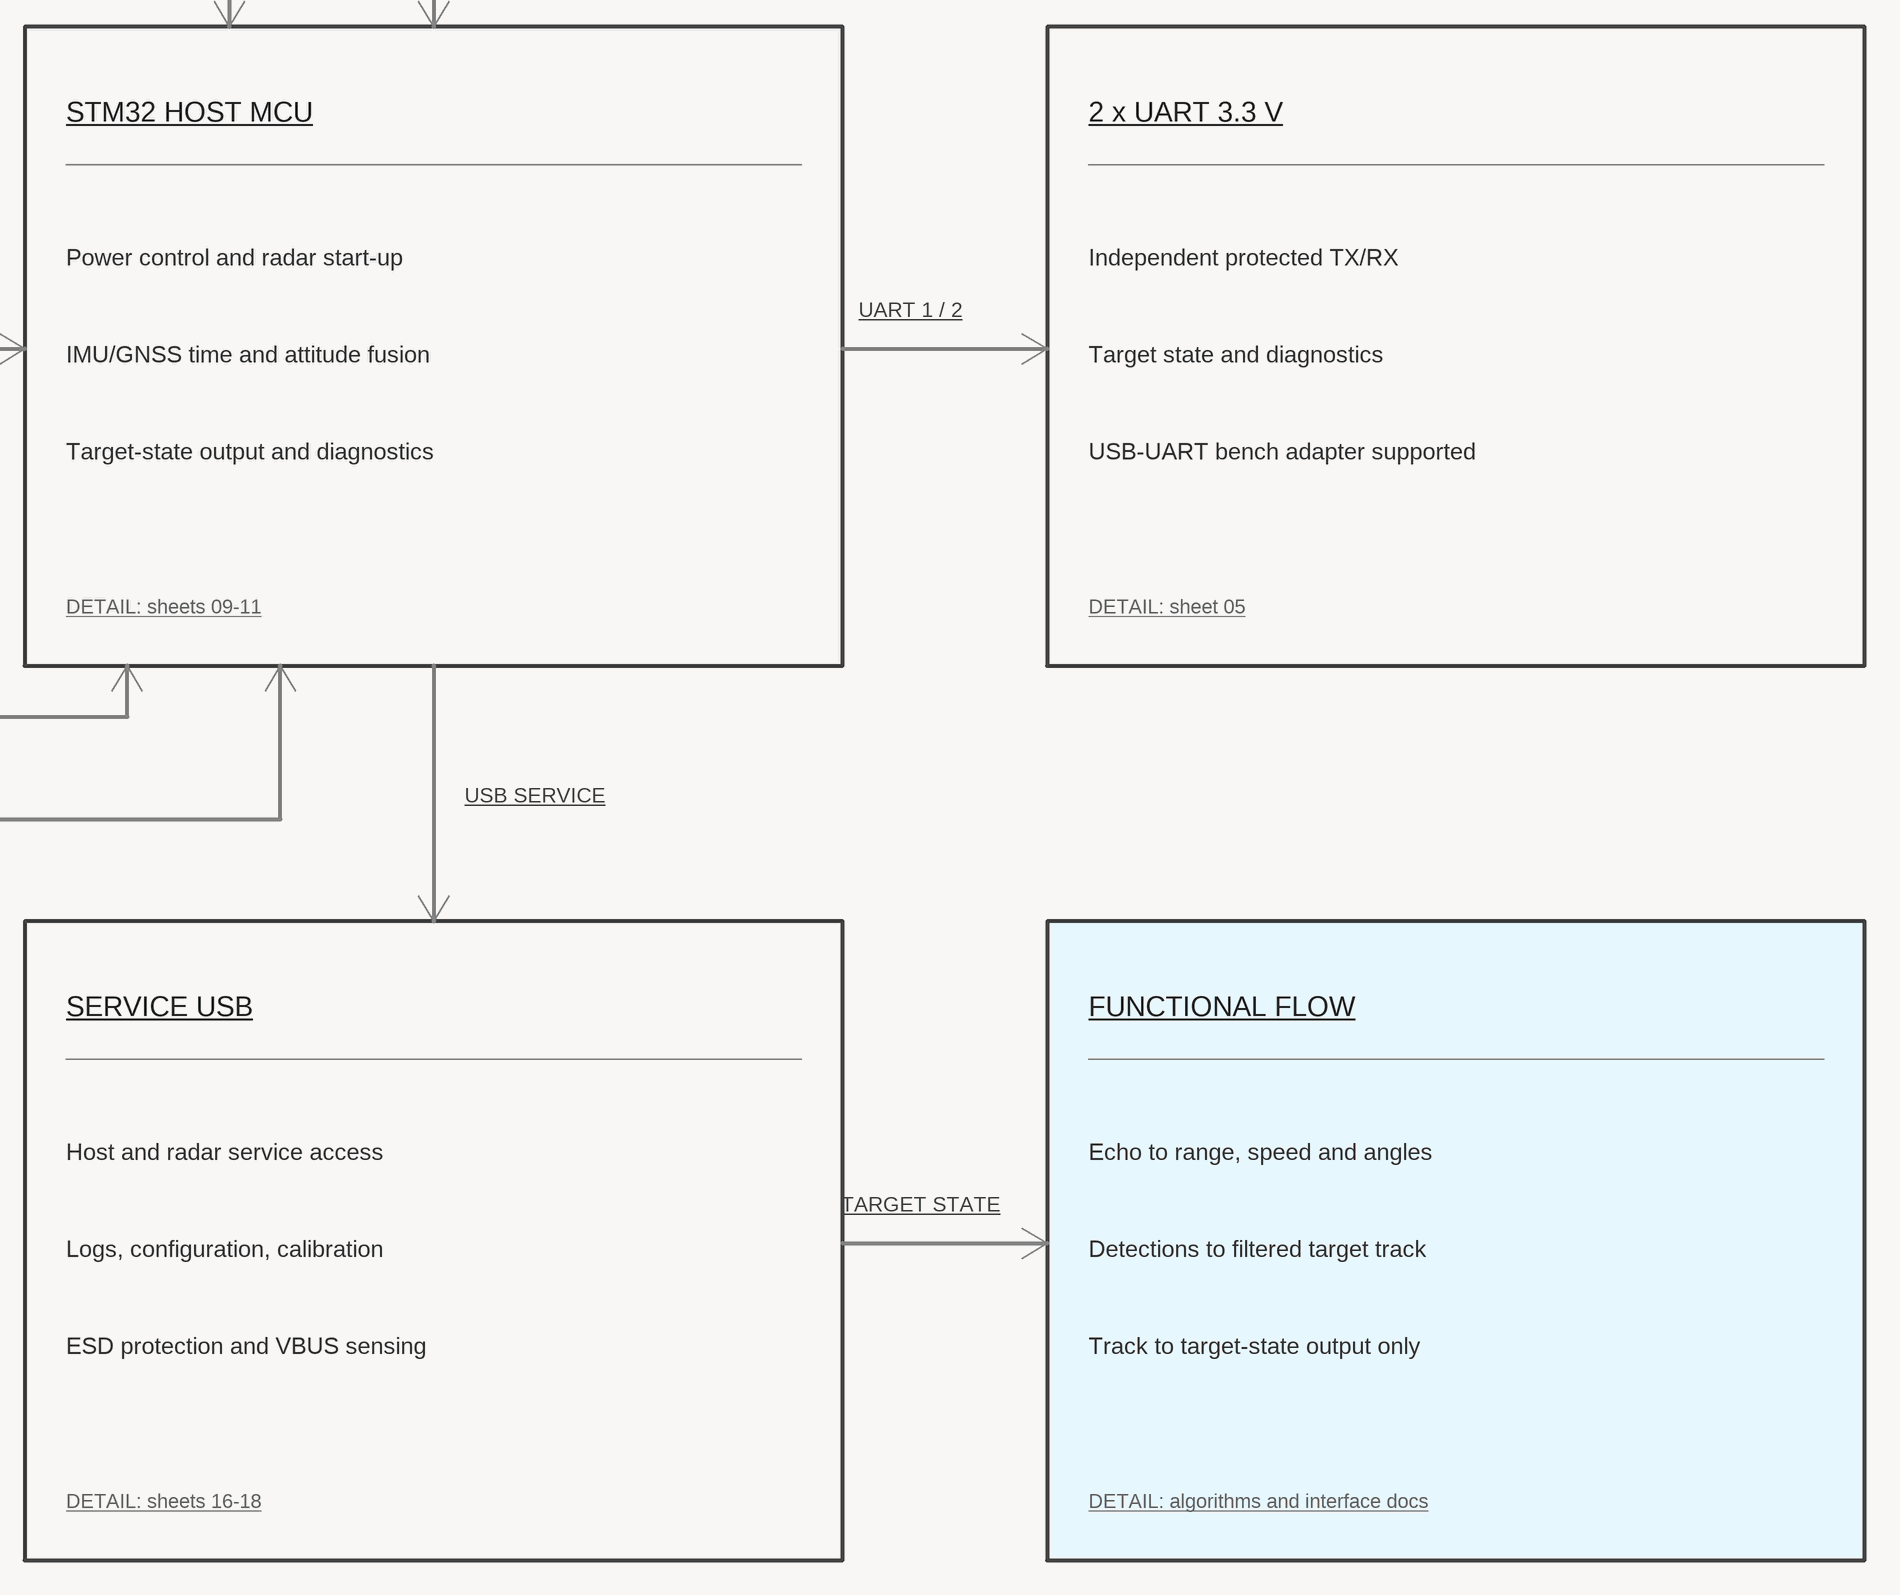
[diagram p37: 00_SYSTEM_OVERVIEW.SchDoc, bottom right]

### Notes on the sheet
- RADAR D79 24V / SYSTEM OVERVIEW / PCB v0.8.0 R9
- Civil drone tracking system. Measurement and target-state output only. No motion-control commands.
- Overview sheet 00 / detailed electrical design: sheets 01-31
- 24 V INPUT
- POWER RAILS
- AWR2944P RADAR
- 76-81 GHz ARRAY
- Reverse and surge protection
- PROTECTED 24 V
- 24 V to 12 V conversion
- 12 V + AUX
- FMCW chirps, four coherent RX
- COHERENT RF
- 4 TX and 4 coherent RX channels
- eFuse, UVLO/OVP, current limit
- 3.3 / 1.8 / 1.2 / 1.0 V rails
- Range, Doppler and phase angles
- Eight patches in each antenna
- Protected 24 V system rail
- Sequencing, filters, test points
- Detection and target tracking only
- Wide elevation, phase angle estimate
- DETAIL: sheets 01-04
- DETAIL: sheets 19-31
- DETAIL: sheets 13-15 and 21-31
- DETAIL: PCB RF layout and antenna report
- GNSS UART + PPS
- CONTROL + DATA
- EXTERNAL GNSS
- IMU
- STM32 HOST MCU
- 2 x UART 3.3 V
- Connector, no soldering required
- Angular rate and acceleration
- SPI + INT
- Power control and radar start-up
- UART 1 / 2
- Independent protected TX/RX
- Time mark and navigation status
- Carrier attitude correction
- IMU/GNSS time and attitude fusion
- Target state and diagnostics
- Optional for radar-only tracking
- Bias and drift calibration
- Target-state output and diagnostics
- USB-UART bench adapter supported
- DETAIL: sheet 08
- DETAIL: sheet 12
- DETAIL: sheets 09-11
- DETAIL: sheet 05
- SWD / RESET / BOOT
- CAN FD
- USB SERVICE
- BOOT AND DEBUG
- SERVICE USB
- FUNCTIONAL FLOW
- SWD, reset and boot settings
- Host and bench diagnostics
- Host and radar service access
- Echo to range, speed and angles
- TARGET STATE
- First-power-up test points
- Sequence, CRC and timeout checks
- Logs, configuration, calibration
- Detections to filtered target track
- Firmware recovery access
- No motion-control commands
- ESD protection and VBUS sensing
- Track to target-state output only
- DETAIL: sheet 07
- DETAIL: sheet 06
- DETAIL: sheets 16-18
- DETAIL: algorithms and interface docs

## Nets that join several sheets
3V3: 01_10_POWER_INPUT (U5.14), 02_10_POWER_INPUT (C2.1), 03_10_POWER_INPUT (L1.2 R5P.2 R6F.2 R7F.2), 04_10_POWER_INPUT (R803.2), 05_60_HOST_UART (R600.1 R605.1), 06_50_RADAR_IO_CAN (C40.1 U4.3), 07_70_DEBUG_BOOT (R70.2), 09_20_MCU_CORE (17 pins), 10_20_MCU_CORE (11 pins), 11_20_MCU_CORE (9 pins), 12_40_IMU (5 pins), 14_Radar_interfaces_and_QSPI (C_FRAME.1 U_FRAME.5)
5V_GNSS: 01_10_POWER_INPUT (U9.14), 02_10_POWER_INPUT (C91.1), 03_10_POWER_INPUT (L9.2), 04_10_POWER_INPUT (R90.2), 08_30_TIME_GNSS (J8.1)
BOOT0: 07_70_DEBUG_BOOT (R70.1), 09_20_MCU_CORE (U1.166), 11_20_MCU_CORE (R10.1)
BUCK5_SW: 01_10_POWER_INPUT (U9.1 U9.2 U9.3), 03_10_POWER_INPUT (L9.1)
BUCK_SW: 01_10_POWER_INPUT (U5.1 U5.2 U5.3), 03_10_POWER_INPUT (L1.1)
CAN_RX: 06_50_RADAR_IO_CAN (U4.4), 09_20_MCU_CORE (U1.142)
CAN_TX: 06_50_RADAR_IO_CAN (U4.1), 09_20_MCU_CORE (U1.143)
GND: 01_10_POWER_INPUT (30 pins), 02_10_POWER_INPUT (14 pins), 03_10_POWER_INPUT (9 pins), 04_10_POWER_INPUT (5 pins), 05_60_HOST_UART (D3.3 D3.8 J6.1 J6.4), 06_50_RADAR_IO_CAN (6 pins), 07_70_DEBUG_BOOT (SW1.2), 08_30_TIME_GNSS (D8.3 D8.8 J8.6), 09_20_MCU_CORE (13 pins), 10_20_MCU_CORE (16 pins), 11_20_MCU_CORE (10 pins), 12_40_IMU (6 pins), 13_Radar_interfaces_and_QSPI (120 pins), 14_Radar_interfaces_and_QSPI (15 pins), 15_Radar_interfaces_and_QSPI (R_CAN_SHDN.2 R_CAN_STB.2 R_FRAME_PD.2), 16_Radar_service_USB_and_boot (16 pins), 17_Radar_service_USB_and_boot (5 pins), 18_Radar_service_USB_and_boot (TP_RAD_GND.1), 19_Radar_12V_to_3V3 (13 pins), 21_Radar_input_and_reference (6 pins), 22_Radar_bypass (15 pins), 23_Radar_bypass (16 pins), 24_Radar_bypass (RAD_C175.1 RAD_C176.1 RAD_C177.1 RAD_C180.2), 25_Radar_PMIC_and_rail_filters (12 pins), 26_Radar_PMIC_and_rail_filters (11 pins), 28_Radar_PMIC_and_rail_filters (RAD_R292.1), 29_Radar_rail_selection_and_sensing (9 pins), 31_Radar_VPP_service (RAD_C145.2 RAD_C149.1 RAD_U27.2)
GNSS_PPS: 08_30_TIME_GNSS (D8.4 J8.4), 09_20_MCU_CORE (U1.40)
GNSS_RX_EXT: 08_30_TIME_GNSS (D8.1 J8.2), 09_20_MCU_CORE (U1.96)
GNSS_TX_EXT: 08_30_TIME_GNSS (D8.2 J8.3), 09_20_MCU_CORE (U1.97)
HOST_UART1_RX: 05_60_HOST_UART (R600.2 R602.2), 09_20_MCU_CORE (U1.150), 11_20_MCU_CORE (TP2.1)
HOST_UART1_TX: 05_60_HOST_UART (R601.2), 09_20_MCU_CORE (U1.147), 11_20_MCU_CORE (TP1.1)
HOST_UART2_RX: 05_60_HOST_UART (R604.2 R605.2), 09_20_MCU_CORE (U1.121)
HOST_UART2_TX: 05_60_HOST_UART (R603.2), 09_20_MCU_CORE (U1.120)
IMU_DRDY: 09_20_MCU_CORE (U1.80), 12_40_IMU (U2.4)
IMU_MISO: 09_20_MCU_CORE (U1.94), 12_40_IMU (U2.1)
IMU_MOSI: 09_20_MCU_CORE (U1.95), 12_40_IMU (U2.14)
IMU_NSS: 09_20_MCU_CORE (U1.92), 12_40_IMU (U2.12)
IMU_SCK: 09_20_MCU_CORE (U1.93), 12_40_IMU (U2.13)
MCU_HSE_25M: 09_20_MCU_CORE (U1.29), 10_20_MCU_CORE (Y1.3)
NRST: 07_70_DEBUG_BOOT (SW1.1), 09_20_MCU_CORE (U1.31), 11_20_MCU_CORE (C115.1)
RAD_CAN_SHDN: 14_Radar_interfaces_and_QSPI (U_CAN_RAD.5), 15_Radar_interfaces_and_QSPI (R_CAN_SHDN.1)
RAD_CAN_STB: 14_Radar_interfaces_and_QSPI (U_CAN_RAD.8), 15_Radar_interfaces_and_QSPI (R_CAN_STB.1)
RAD_FRAME_RAW: 13_Radar_interfaces_and_QSPI (RAD_U29.G15), 14_Radar_interfaces_and_QSPI (U_FRAME.2), 15_Radar_interfaces_and_QSPI (R_FRAME_PD.1)
RADAR_12V: 01_10_POWER_INPUT (U7.6), 19_Radar_12V_to_3V3 (5 pins), 21_Radar_input_and_reference (RAD_C99.1 RAD_C101.1 RAD_L5.2)
RADAR_CANH: 06_50_RADAR_IO_CAN (D4.1 R40.1 U4.7), 14_Radar_interfaces_and_QSPI (U_CAN_RAD.7), 15_Radar_interfaces_and_QSPI (R_CAN_TERM.1)
RADAR_CANL: 06_50_RADAR_IO_CAN (D4.2 R40.2 U4.6), 14_Radar_interfaces_and_QSPI (U_CAN_RAD.6), 15_Radar_interfaces_and_QSPI (R_CAN_TERM.2)
RADAR_EFUSE_FLT: 01_10_POWER_INPUT (U7.4), 03_10_POWER_INPUT (R7F.1), 09_20_MCU_CORE (U1.2)
RADAR_REF: 09_20_MCU_CORE (U1.79), 14_Radar_interfaces_and_QSPI (U_FRAME.4)
SWCLK: 09_20_MCU_CORE (U1.137), 10_20_MCU_CORE (J10.4)
SWDIO: 09_20_MCU_CORE (U1.124), 10_20_MCU_CORE (J10.2)
SWO: 09_20_MCU_CORE (U1.161), 10_20_MCU_CORE (J10.6)
SYS_EFUSE_FLT: 01_10_POWER_INPUT (U6.14), 03_10_POWER_INPUT (R6F.1), 09_20_MCU_CORE (U1.1)
TI_1V0: 13_Radar_interfaces_and_QSPI (RAD_U29.D6 RAD_U29.D7 RAD_U29.M4), 22_Radar_bypass (7 pins), 23_Radar_bypass (RAD_C117.2), 29_Radar_rail_selection_and_sensing (RAD_U22.8), 30_Radar_rail_selection_and_sensing (RAD_R56.1 RAD_R64.2)
TI_1V0_FILTERED: 27_Radar_PMIC_and_rail_filters (RAD_R73.2 RAD_R111.2), 30_Radar_rail_selection_and_sensing (RAD_R64.1 RAD_R66.1)
TI_1V2: 13_Radar_interfaces_and_QSPI (19 pins), 22_Radar_bypass (RAD_C92.2 RAD_C96.2), 23_Radar_bypass (7 pins), 29_Radar_rail_selection_and_sensing (RAD_R26.1 RAD_R30.2 RAD_U9.8)
TI_1V4_APLL: 13_Radar_interfaces_and_QSPI (RAD_U29.H4), 22_Radar_bypass (RAD_C103.1)
TI_1V4_SYNTH: 13_Radar_interfaces_and_QSPI (RAD_U29.G4), 22_Radar_bypass (RAD_C102.1)
TI_1V8: 13_Radar_interfaces_and_QSPI (9 pins), 22_Radar_bypass (6 pins), 23_Radar_bypass (6 pins), 29_Radar_rail_selection_and_sensing (RAD_U11.8), 30_Radar_rail_selection_and_sensing (RAD_R47.1 RAD_R60.2)
TI_1V8_FILTERED: 27_Radar_PMIC_and_rail_filters (RAD_R104.2), 30_Radar_rail_selection_and_sensing (RAD_R60.1 RAD_R65.1)
TI_3V3: 13_Radar_interfaces_and_QSPI (5 pins), 23_Radar_bypass (RAD_C174.2), 24_Radar_bypass (RAD_C175.2 RAD_C176.2 RAD_C177.2), 29_Radar_rail_selection_and_sensing (RAD_U12.8), 30_Radar_rail_selection_and_sensing (RAD_R346.2 RAD_R348.1)
TI_3V3_VIO: 14_Radar_interfaces_and_QSPI (C_CAN_RAD.1 U_CAN_RAD.3), 15_Radar_interfaces_and_QSPI (5 pins), 16_Radar_service_USB_and_boot (6 pins), 17_Radar_service_USB_and_boot (5 pins), 18_Radar_service_USB_and_boot (TP_RAD_VIO.1), 21_Radar_input_and_reference (RAD_R276.2 RAD_R277.2), 27_Radar_PMIC_and_rail_filters (RAD_R106.2 RAD_R116.2), 30_Radar_rail_selection_and_sensing (RAD_R346.1 RAD_R352.1), 31_Radar_VPP_service (RAD_R409.2)
TI_3V3REG_MODE: 19_Radar_12V_to_3V3 (RAD_U2.6), 20_Radar_12V_to_3V3 (RAD_R9.1)
TI_3V3REG_VCC: 19_Radar_12V_to_3V3 (RAD_C10.1 RAD_U2.3), 20_Radar_12V_to_3V3 (RAD_R9.2)
TI_5V0: 14_Radar_interfaces_and_QSPI (RAD_U8.10), 25_Radar_PMIC_and_rail_filters (RAD_C119.1)
TI_+3.3VD: 14_Radar_interfaces_and_QSPI (RAD_U8.9), 25_Radar_PMIC_and_rail_filters (RAD_C124.2), 27_Radar_PMIC_and_rail_filters (RAD_R116.1)
TI_AGND: 14_Radar_interfaces_and_QSPI (RAD_U8.5 RAD_U8.5-19 RAD_U8.19), 25_Radar_PMIC_and_rail_filters (RAD_C3.1 RAD_C123.1 RAD_C124.1), 26_Radar_PMIC_and_rail_filters (RAD_NT1.2 RAD_NT2.1 RAD_NT3.1 RAD_NT4.1)
TI_AR_NERROUT: 13_Radar_interfaces_and_QSPI (RAD_U29.C11), 27_Radar_PMIC_and_rail_filters (RAD_R76.1)
TI_AR_NRST: 13_Radar_interfaces_and_QSPI (RAD_U29.H16), 16_Radar_service_USB_and_boot (RAD_C105.2 RAD_R264.1), 18_Radar_service_USB_and_boot (TP_RAD_RESET.1), 27_Radar_PMIC_and_rail_filters (RAD_R99.1)
TI_FB_B1: 14_Radar_interfaces_and_QSPI (RAD_U8.3), 27_Radar_PMIC_and_rail_filters (RAD_R14.1)
TI_FB_B2: 14_Radar_interfaces_and_QSPI (RAD_U8.21), 27_Radar_PMIC_and_rail_filters (RAD_R71.1)
TI_FB_B3: 14_Radar_interfaces_and_QSPI (RAD_U8.17), 28_Radar_PMIC_and_rail_filters (RAD_R291.1)
TI_MSS_I2CA_SCL: 21_Radar_input_and_reference (RAD_R276.1), 29_Radar_rail_selection_and_sensing (RAD_R27.2), 30_Radar_rail_selection_and_sensing (RAD_R33.2 RAD_R57.2 RAD_R58.2)
TI_MSS_I2CA_SDA: 21_Radar_input_and_reference (RAD_R277.1), 29_Radar_rail_selection_and_sensing (RAD_R29.2), 30_Radar_rail_selection_and_sensing (RAD_R35.2 RAD_R59.2 RAD_R62.2)
TI_MSS_MCANA_RX: 13_Radar_interfaces_and_QSPI (RAD_U29.D16), 14_Radar_interfaces_and_QSPI (U_CAN_RAD.4)
TI_MSS_MCANA_TX: 13_Radar_interfaces_and_QSPI (RAD_U29.D17), 14_Radar_interfaces_and_QSPI (U_CAN_RAD.1)
TI_MSS_UARTA_RX: 13_Radar_interfaces_and_QSPI (RAD_U29.B16), 16_Radar_service_USB_and_boot (RAD_R129.1)
TI_NERR_MCU: 14_Radar_interfaces_and_QSPI (RAD_U8.16), 27_Radar_PMIC_and_rail_filters (RAD_R76.2)
TI_NetC1_2: 14_Radar_interfaces_and_QSPI (RAD_C1.2 RAD_C2.2 RAD_U1.8), 15_Radar_interfaces_and_QSPI (RAD_R37.2)
TI_NetC17_1: 29_Radar_rail_selection_and_sensing (RAD_C17.1 RAD_U11.9), 30_Radar_rail_selection_and_sensing (RAD_R47.2)
TI_NetC17_2: 29_Radar_rail_selection_and_sensing (RAD_C17.2 RAD_U11.10), 30_Radar_rail_selection_and_sensing (RAD_R65.2)
TI_NetC19_1: 29_Radar_rail_selection_and_sensing (RAD_C19.1 RAD_U12.9), 30_Radar_rail_selection_and_sensing (RAD_R348.2)
TI_NetC19_2: 29_Radar_rail_selection_and_sensing (RAD_C19.2 RAD_U12.10), 30_Radar_rail_selection_and_sensing (RAD_R352.2)
TI_NetC81_1: 29_Radar_rail_selection_and_sensing (RAD_C81.1 RAD_U22.9), 30_Radar_rail_selection_and_sensing (RAD_R56.2)
TI_NetC81_2: 29_Radar_rail_selection_and_sensing (RAD_C81.2 RAD_U22.10), 30_Radar_rail_selection_and_sensing (RAD_R66.2)
TI_NetC123_2: 14_Radar_interfaces_and_QSPI (RAD_U8.18), 25_Radar_PMIC_and_rail_filters (RAD_C123.2)
TI_NetL1_1: 14_Radar_interfaces_and_QSPI (RAD_U8.11), 26_Radar_PMIC_and_rail_filters (RAD_L1.1)
TI_NetR33_1: 29_Radar_rail_selection_and_sensing (RAD_U11.5), 30_Radar_rail_selection_and_sensing (RAD_R33.1)
TI_NetR35_1: 29_Radar_rail_selection_and_sensing (RAD_U11.4), 30_Radar_rail_selection_and_sensing (RAD_R35.1)
TI_NetR57_1: 29_Radar_rail_selection_and_sensing (RAD_U22.5), 30_Radar_rail_selection_and_sensing (RAD_R57.1)
TI_NetR58_1: 29_Radar_rail_selection_and_sensing (RAD_U12.5), 30_Radar_rail_selection_and_sensing (RAD_R58.1)
TI_NetR59_1: 29_Radar_rail_selection_and_sensing (RAD_U12.4), 30_Radar_rail_selection_and_sensing (RAD_R59.1)
TI_NetR62_1: 29_Radar_rail_selection_and_sensing (RAD_U22.2 RAD_U22.4), 30_Radar_rail_selection_and_sensing (RAD_R62.1)
TI_NetR63_1: 14_Radar_interfaces_and_QSPI (RAD_U8.1), 27_Radar_PMIC_and_rail_filters (RAD_R63.1)
TI_NetR186_1: 14_Radar_interfaces_and_QSPI (RAD_U8.8), 27_Radar_PMIC_and_rail_filters (RAD_R186.1)
TI_NetR190_2: 14_Radar_interfaces_and_QSPI (RAD_U8.4), 27_Radar_PMIC_and_rail_filters (RAD_R190.2), 28_Radar_PMIC_and_rail_filters (RAD_R292.2)
TI_NetR193_1: 14_Radar_interfaces_and_QSPI (RAD_U8.2), 27_Radar_PMIC_and_rail_filters (RAD_R193.1)
TI_NetR298_1: 16_Radar_service_USB_and_boot (RAD_R299.2), 17_Radar_service_USB_and_boot (RAD_R300.1 RAD_R302.2)
TI_NetR386_2: 13_Radar_interfaces_and_QSPI (RAD_U29.D15), 17_Radar_service_USB_and_boot (RAD_R386.2)
TI_NetTP8_1: 14_Radar_interfaces_and_QSPI (RAD_U8.22), 28_Radar_PMIC_and_rail_filters (RAD_TP8.1)
TI_NRSTOUT: 14_Radar_interfaces_and_QSPI (RAD_U8.6), 27_Radar_PMIC_and_rail_filters (RAD_R99.2)
TI_PMIC_CLK_OUT: 13_Radar_interfaces_and_QSPI (RAD_U29.T17), 16_Radar_service_USB_and_boot (RAD_R218.1)
TI_PMIC_EN: 14_Radar_interfaces_and_QSPI (RAD_U8.15), 27_Radar_PMIC_and_rail_filters (RAD_R125.1)
TI_PMIC_NINT: 14_Radar_interfaces_and_QSPI (RAD_U8.7), 26_Radar_PMIC_and_rail_filters (RAD_R13.2), 27_Radar_PMIC_and_rail_filters (RAD_R17.2 RAD_R106.1)
TI_PMICOUT_1V0: 25_Radar_PMIC_and_rail_filters (RAD_C132.1 RAD_C134.1), 26_Radar_PMIC_and_rail_filters (RAD_L8.2), 27_Radar_PMIC_and_rail_filters (RAD_R71.2 RAD_R73.1 RAD_R111.1)
TI_PMICOUT_1V2: 25_Radar_PMIC_and_rail_filters (RAD_C129.1 RAD_C130.1), 26_Radar_PMIC_and_rail_filters (RAD_L2.2), 28_Radar_PMIC_and_rail_filters (RAD_R291.2), 29_Radar_rail_selection_and_sensing (RAD_R30.1 RAD_R32.1)
TI_PMICOUT_1V8: 21_Radar_input_and_reference (RAD_C60.1), 25_Radar_PMIC_and_rail_filters (RAD_C125.1), 26_Radar_PMIC_and_rail_filters (RAD_L9.2), 27_Radar_PMIC_and_rail_filters (RAD_R14.2 RAD_R104.1)
TI_PVIN3V3: 14_Radar_interfaces_and_QSPI (RAD_U8.13 RAD_U8.20 RAD_U8.25 RAD_U8.27), 25_Radar_PMIC_and_rail_filters (9 pins), 26_Radar_PMIC_and_rail_filters (8 pins), 27_Radar_PMIC_and_rail_filters (RAD_R125.2), 28_Radar_PMIC_and_rail_filters (RAD_R200.2)
TI_QSPI_CS: 13_Radar_interfaces_and_QSPI (RAD_U29.U12), 14_Radar_interfaces_and_QSPI (RAD_U1.1), 15_Radar_interfaces_and_QSPI (RAD_R38.1)
TI_QSPI_D0: 13_Radar_interfaces_and_QSPI (RAD_U29.U11), 15_Radar_interfaces_and_QSPI (RAD_R45.2)
TI_QSPI_D0_FLASH: 14_Radar_interfaces_and_QSPI (RAD_U1.5), 15_Radar_interfaces_and_QSPI (RAD_R45.1)
TI_QSPI_D1: 13_Radar_interfaces_and_QSPI (RAD_U29.V11), 15_Radar_interfaces_and_QSPI (RAD_R39.1 RAD_R49.1)
TI_QSPI_D1_FLASH: 14_Radar_interfaces_and_QSPI (RAD_U1.2), 15_Radar_interfaces_and_QSPI (RAD_R39.2)
TI_QSPI_D2: 13_Radar_interfaces_and_QSPI (RAD_U29.T11), 15_Radar_interfaces_and_QSPI (RAD_R42.1 RAD_R43.1)
TI_QSPI_D2_FLASH: 14_Radar_interfaces_and_QSPI (RAD_U1.3), 15_Radar_interfaces_and_QSPI (RAD_R42.2)
TI_QSPI_D3: 13_Radar_interfaces_and_QSPI (RAD_U29.R12), 15_Radar_interfaces_and_QSPI (RAD_R40.2 RAD_R41.1)
TI_QSPI_D3_FLASH: 14_Radar_interfaces_and_QSPI (RAD_U1.7), 15_Radar_interfaces_and_QSPI (RAD_R40.1)
TI_QSPI_SCLK: 13_Radar_interfaces_and_QSPI (RAD_U29.R10), 15_Radar_interfaces_and_QSPI (RAD_R44.2)
TI_QSPI_SCLK_FLASH: 14_Radar_interfaces_and_QSPI (RAD_U1.6), 15_Radar_interfaces_and_QSPI (RAD_R44.1)
TI_REGOUT_3V3: 19_Radar_12V_to_3V3 (7 pins), 28_Radar_PMIC_and_rail_filters (RAD_R200.1), 29_Radar_rail_selection_and_sensing (6 pins), 31_Radar_VPP_service (RAD_C145.1 RAD_U27.1)
TI_SOP1_MSS_SPIB_CS2: 13_Radar_interfaces_and_QSPI (RAD_U29.R14), 17_Radar_service_USB_and_boot (RAD_R305.1)
TI_SOP3_MSS_UARTB_TX: 13_Radar_interfaces_and_QSPI (RAD_U29.A14), 17_Radar_service_USB_and_boot (RAD_R301.1)
TI_SOP4_MSS_UARTA_TX: 13_Radar_interfaces_and_QSPI (RAD_U29.C16), 16_Radar_service_USB_and_boot (RAD_R128.1), 17_Radar_service_USB_and_boot (RAD_R309.1)
TI_SW_B1: 14_Radar_interfaces_and_QSPI (RAD_U8.28), 26_Radar_PMIC_and_rail_filters (RAD_L9.1)
TI_SW_B2: 14_Radar_interfaces_and_QSPI (RAD_U8.24), 26_Radar_PMIC_and_rail_filters (RAD_L8.1)
TI_SW_B3: 14_Radar_interfaces_and_QSPI (RAD_U8.14), 26_Radar_PMIC_and_rail_filters (RAD_L2.1)
TI_SYNCCLKIN: 14_Radar_interfaces_and_QSPI (RAD_U8.23), 27_Radar_PMIC_and_rail_filters (RAD_R75.2)
TI_VBGAP: 13_Radar_interfaces_and_QSPI (RAD_U29.K4), 24_Radar_bypass (RAD_C180.1)
TI_VPP_1P7: 13_Radar_interfaces_and_QSPI (RAD_U29.U3), 23_Radar_bypass (RAD_C150.2), 31_Radar_VPP_service (RAD_P1.1)
TI_XTALM: 13_Radar_interfaces_and_QSPI (RAD_U29.B1), 14_Radar_interfaces_and_QSPI (RAD_C108.1 RAD_Y3.3)
TI_XTALP: 13_Radar_interfaces_and_QSPI (RAD_U29.D1), 14_Radar_interfaces_and_QSPI (RAD_C106.1 RAD_Y3.1)
U5_PG: 01_10_POWER_INPUT (U5.4), 03_10_POWER_INPUT (R5P.1)
U5_SS_LOCAL: 01_10_POWER_INPUT (U5.9), 02_10_POWER_INPUT (C3.1)
U6_BGATE: 01_10_POWER_INPUT (Q6.4 U6.3), 02_10_POWER_INPUT (Q7.3)
U6_DRV: 01_10_POWER_INPUT (U6.4), 02_10_POWER_INPUT (Q7.1)
U6_DVDT: 01_10_POWER_INPUT (U6.9), 02_10_POWER_INPUT (C6D.1)
U6_ILIM_LOCAL: 01_10_POWER_INPUT (U6.10), 03_10_POWER_INPUT (R1.1)
U6_OVP_LOCAL: 01_10_POWER_INPUT (U6.7), 04_10_POWER_INPUT (R62.2 R63.1)
U6_PGTH_LOCAL: 01_10_POWER_INPUT (U6.15), 04_10_POWER_INPUT (R804.2 R805.1)
U6_UVLO_LOCAL: 01_10_POWER_INPUT (U6.6), 04_10_POWER_INPUT (R61.2 R62.1)
U7_DVDT: 01_10_POWER_INPUT (U7.7), 02_10_POWER_INPUT (C7D.1)
U7_ILIM_LOCAL: 01_10_POWER_INPUT (U7.9), 03_10_POWER_INPUT (R2.1)
U7_OVLO_LOCAL: 01_10_POWER_INPUT (U7.2), 04_10_POWER_INPUT (R72.2 R73.1)
U7_UVLO_LOCAL: 01_10_POWER_INPUT (U7.1), 04_10_POWER_INPUT (R71.2 R72.1)
U8_BOOT: 01_10_POWER_INPUT (U8.6), 03_10_POWER_INPUT (C805.1)
U8_ENABLE: 01_10_POWER_INPUT (U6.16 U8.18), 04_10_POWER_INPUT (R806.1)
U8_FB_LOCAL: 01_10_POWER_INPUT (U8.12), 04_10_POWER_INPUT (R800.2 R801.1)
U8_PGOOD: 01_10_POWER_INPUT (U8.16), 04_10_POWER_INPUT (R803.1)
U8_RT_LOCAL: 01_10_POWER_INPUT (U8.10), 04_10_POWER_INPUT (R802.1)
U8_SW: 01_10_POWER_INPUT (5 pins), 03_10_POWER_INPUT (C805.2 L8.1)
U8_VCC: 01_10_POWER_INPUT (U8.8), 03_10_POWER_INPUT (C803.1)
U9_PG: 01_10_POWER_INPUT (U9.4), 04_10_POWER_INPUT (R90.1)
U9_SS_LOCAL: 01_10_POWER_INPUT (U9.9), 02_10_POWER_INPUT (C92.1)
USB_BRIDGE_RESET_N: 16_Radar_service_USB_and_boot (U_USB.9), 17_Radar_service_USB_and_boot (R_USB_RESET.2)
USB_CTS_N: 16_Radar_service_USB_and_boot (U_USB.15), 17_Radar_service_USB_and_boot (R_USB_CTS.2)
USB_VBUS: 16_Radar_service_USB_and_boot (D_USB.4 JUSB1.1), 17_Radar_service_USB_and_boot (R_USB_VBUS_H.1)
USB_VBUS_SENSE: 16_Radar_service_USB_and_boot (U_USB.8), 17_Radar_service_USB_and_boot (R_USB_VBUS_H.2 R_USB_VBUS_L.1)
USB_WAKE_N: 16_Radar_service_USB_and_boot (U_USB.13), 17_Radar_service_USB_and_boot (R_USB_WAKE.2)
V12_SYS: 01_10_POWER_INPUT (10 pins), 02_10_POWER_INPUT (C1.1 C4.1 C90.1 C93.1), 03_10_POWER_INPUT (6 pins), 04_10_POWER_INPUT (R71.1 R800.1)
VCAP1_LOCAL: 09_20_MCU_CORE (U1.81), 10_20_MCU_CORE (C10.1)
VCAP2_LOCAL: 09_20_MCU_CORE (U1.125), 10_20_MCU_CORE (C11.1)
VDDA_FILTERED: 09_20_MCU_CORE (U1.38 U1.39), 10_20_MCU_CORE (C13.1 C14.1), 11_20_MCU_CORE (FB1.2)
VIN_PROTECTED_24V: 01_10_POWER_INPUT (5 pins), 02_10_POWER_INPUT (C800.1 C801.1 C802.1), 04_10_POWER_INPUT (R804.1 R806.2)
VIN_RAW: 01_10_POWER_INPUT (5 pins), 02_10_POWER_INPUT (C6I.1 Q7.2), 03_10_POWER_INPUT (D1.1), 04_10_POWER_INPUT (R61.1)